# EasyEDA Pro project ProPrj_CSDR_2026-11-13.epro, schematic Schematic1, sheets 5 to 10 of 14

## Sheets
5 TX_MIXER: Create Date: 2026-09-30; Page Name: P1; Update Date: 2026-09-30
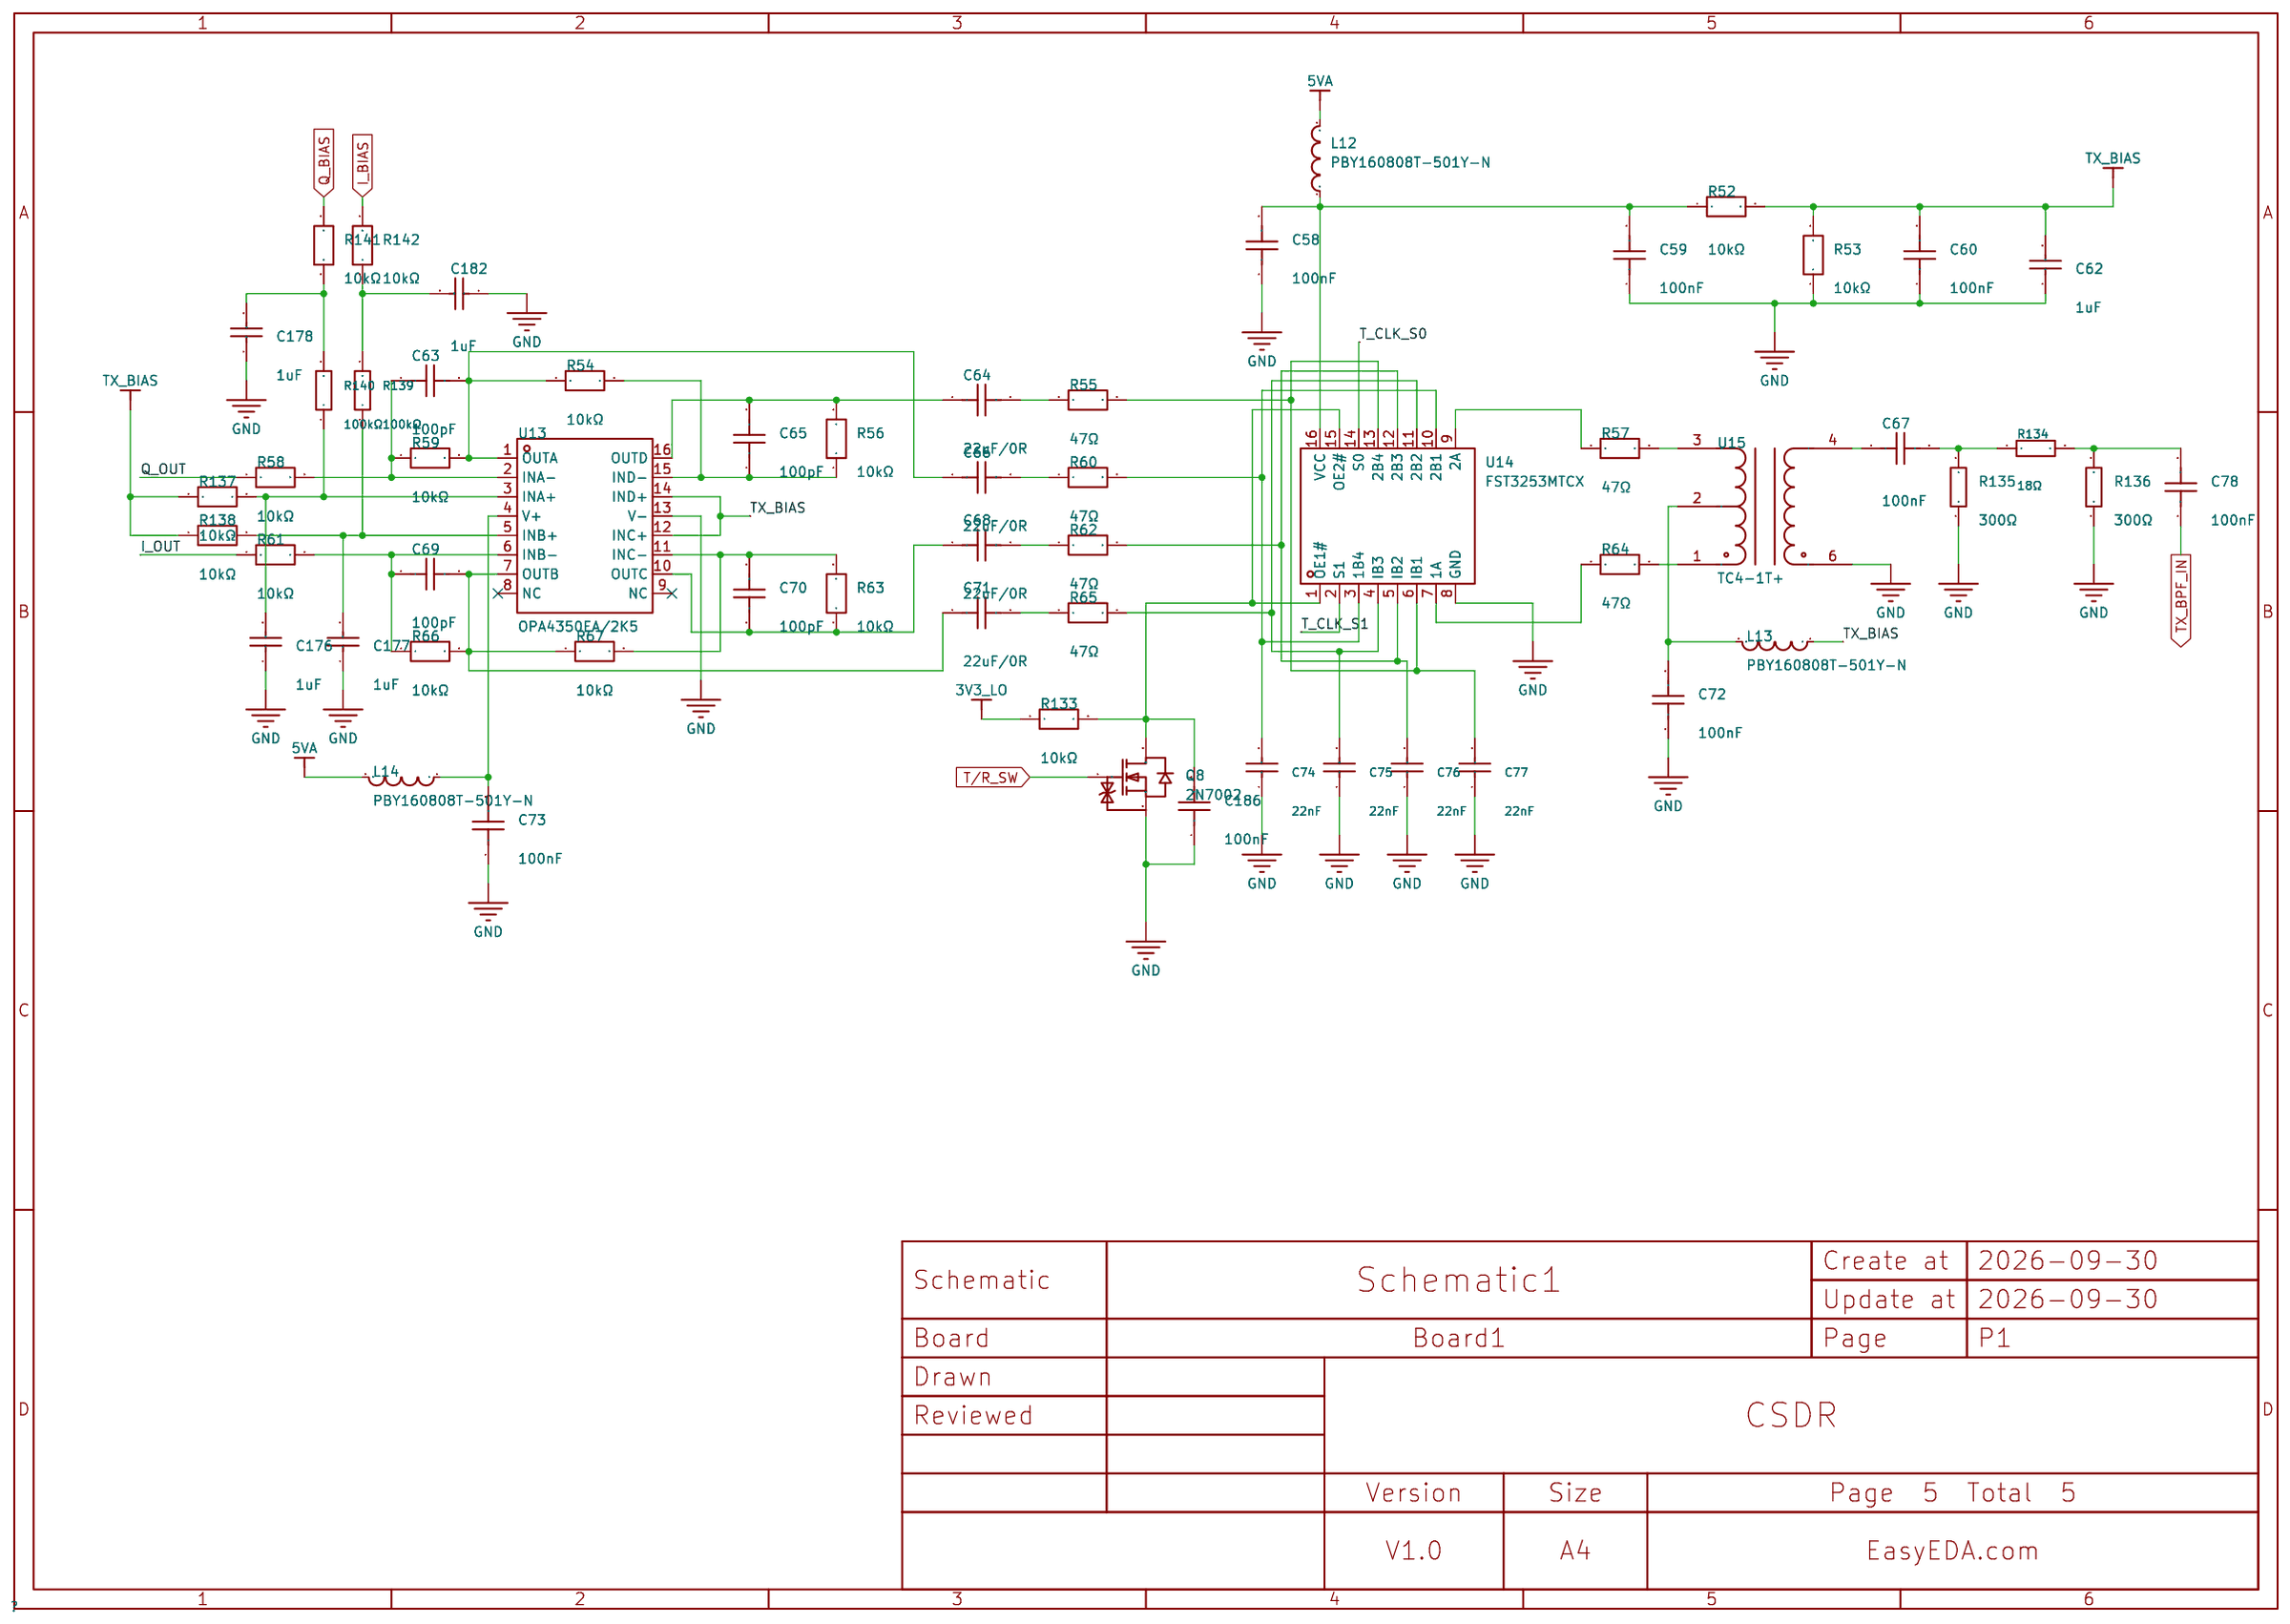
[diagram p6: TX_MIXER]
6 TX_MIXER_PREAMP: Create Date: 2026-10-01; Page Name: P1; Update Date: 2026-10-01
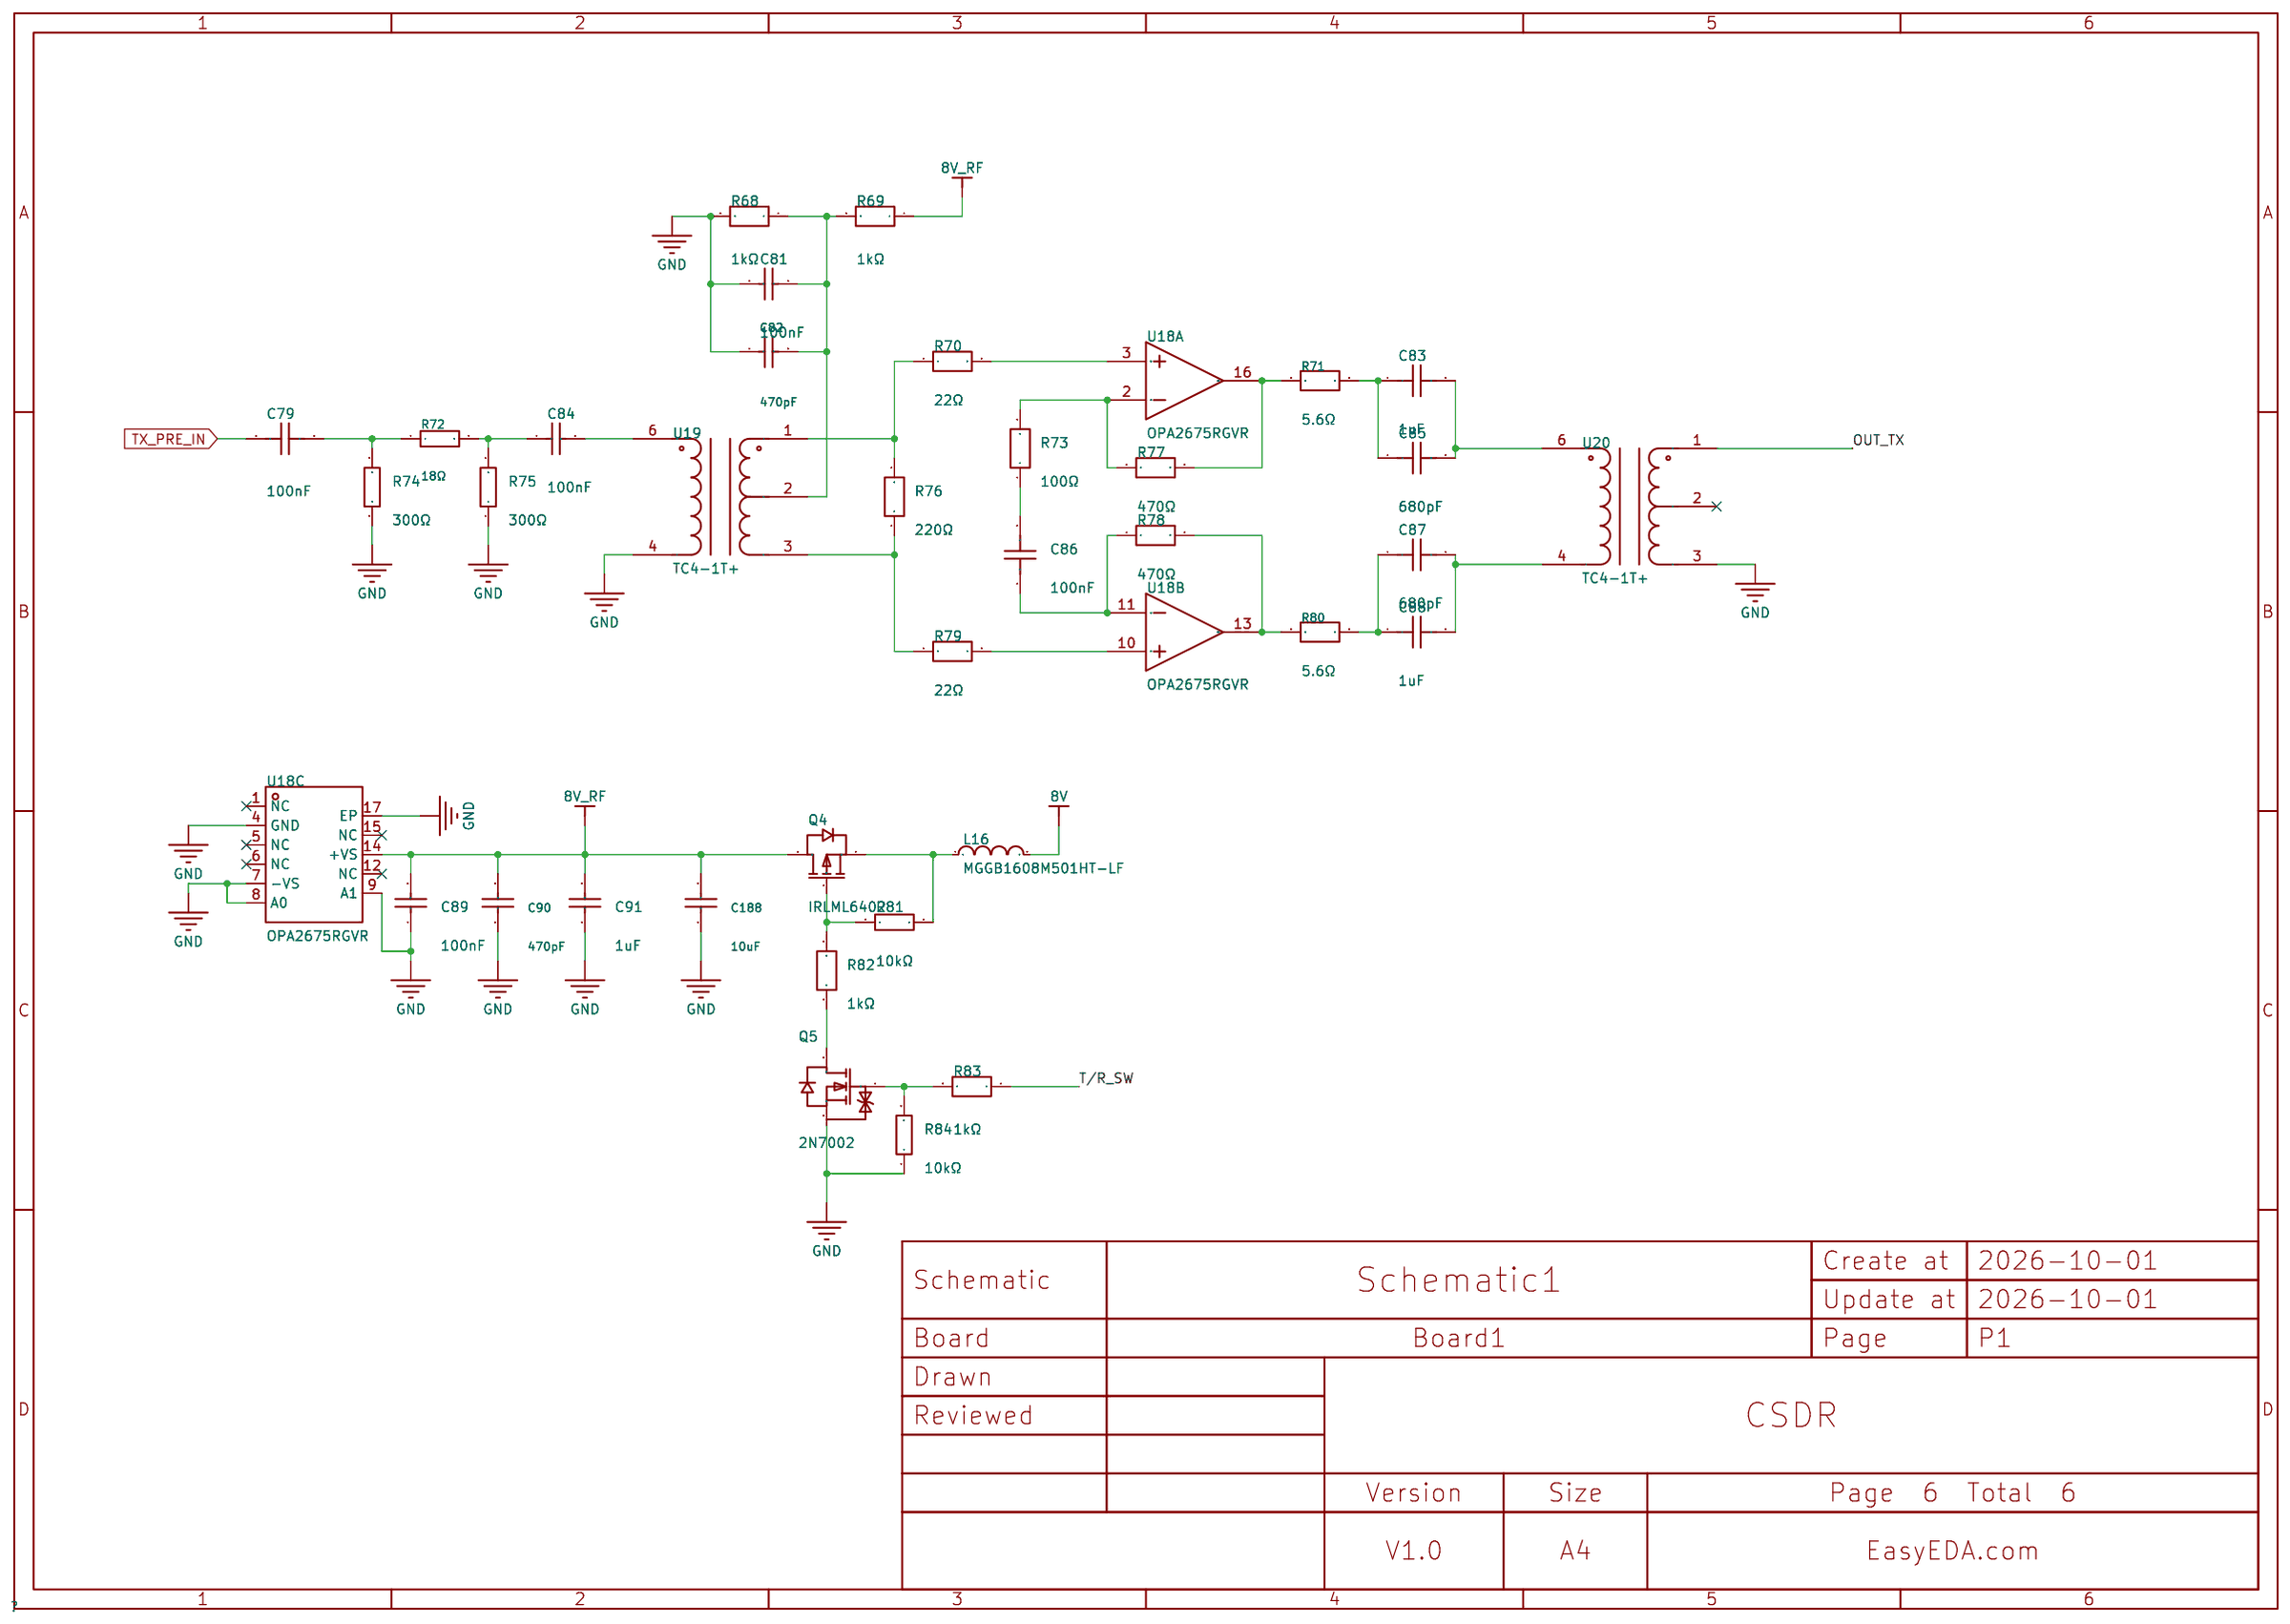
[diagram p7: TX_MIXER_PREAMP]
7 BPF_CONTROL: Create Date: 2026-10-02; Page Name: P1; Update Date: 2026-10-02
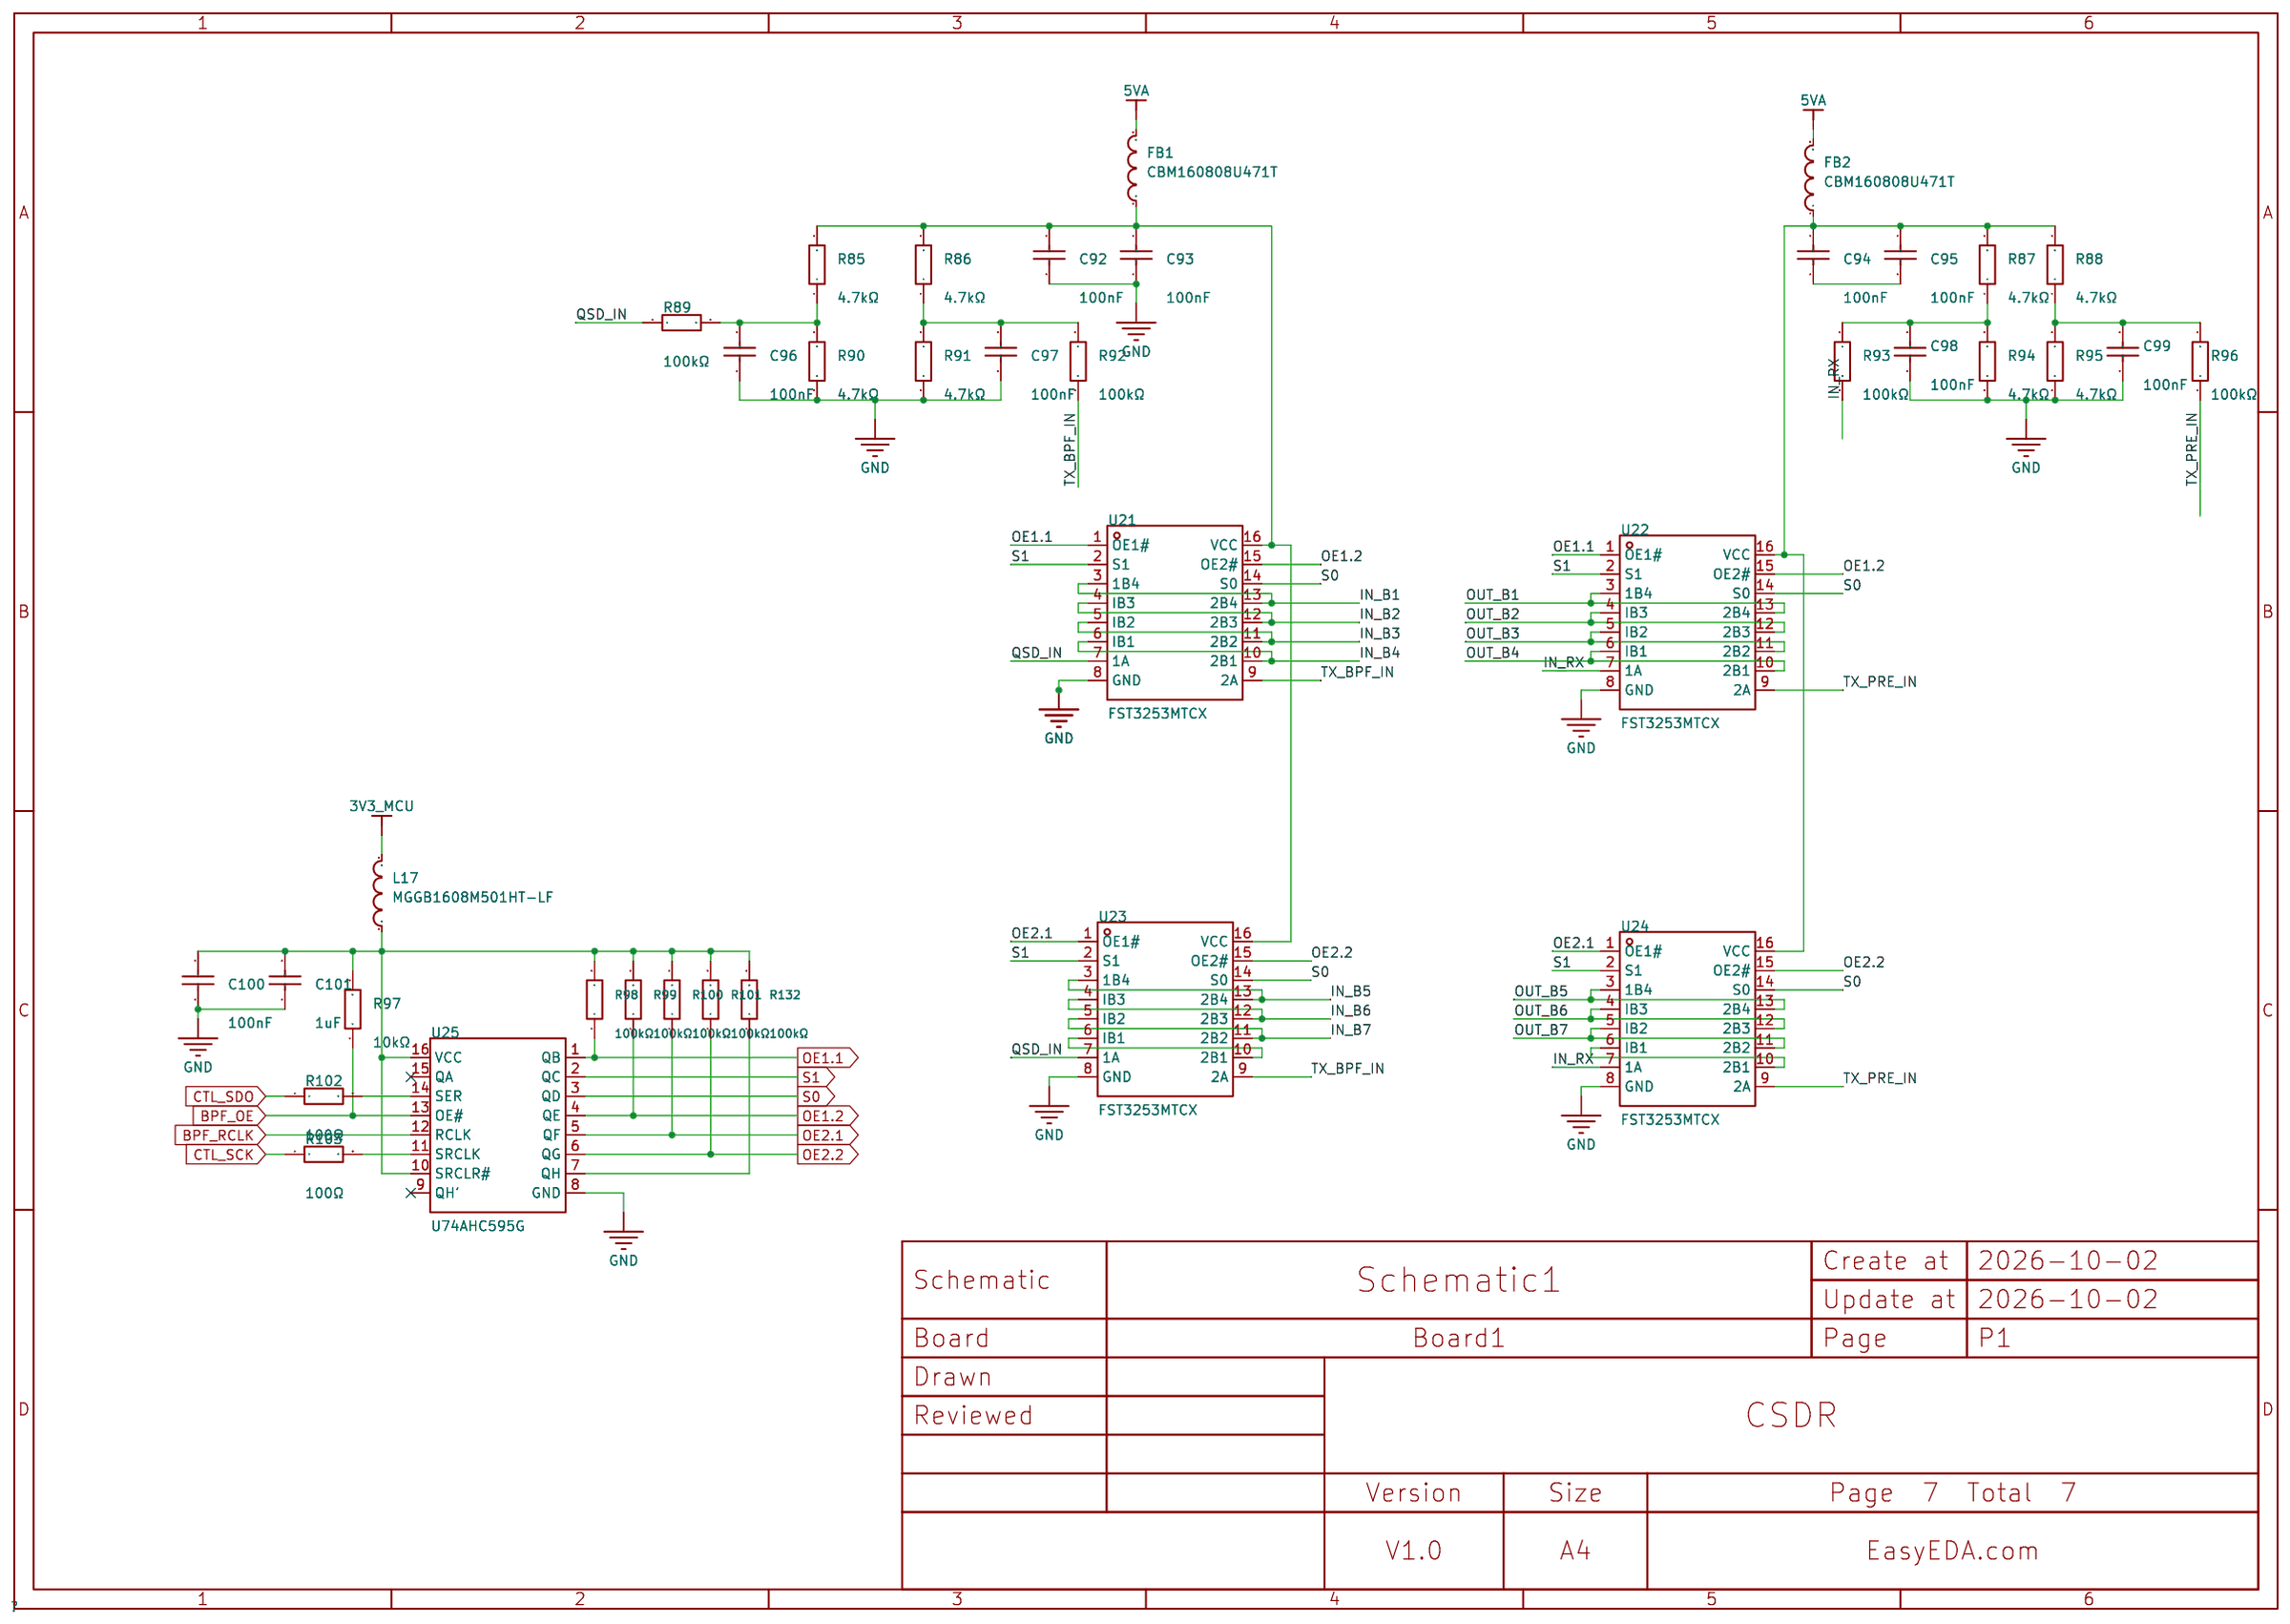
[diagram p8: BPF_CONTROL]
8 BPF: Create Date: 2026-10-03; Update Date: 2026-10-03
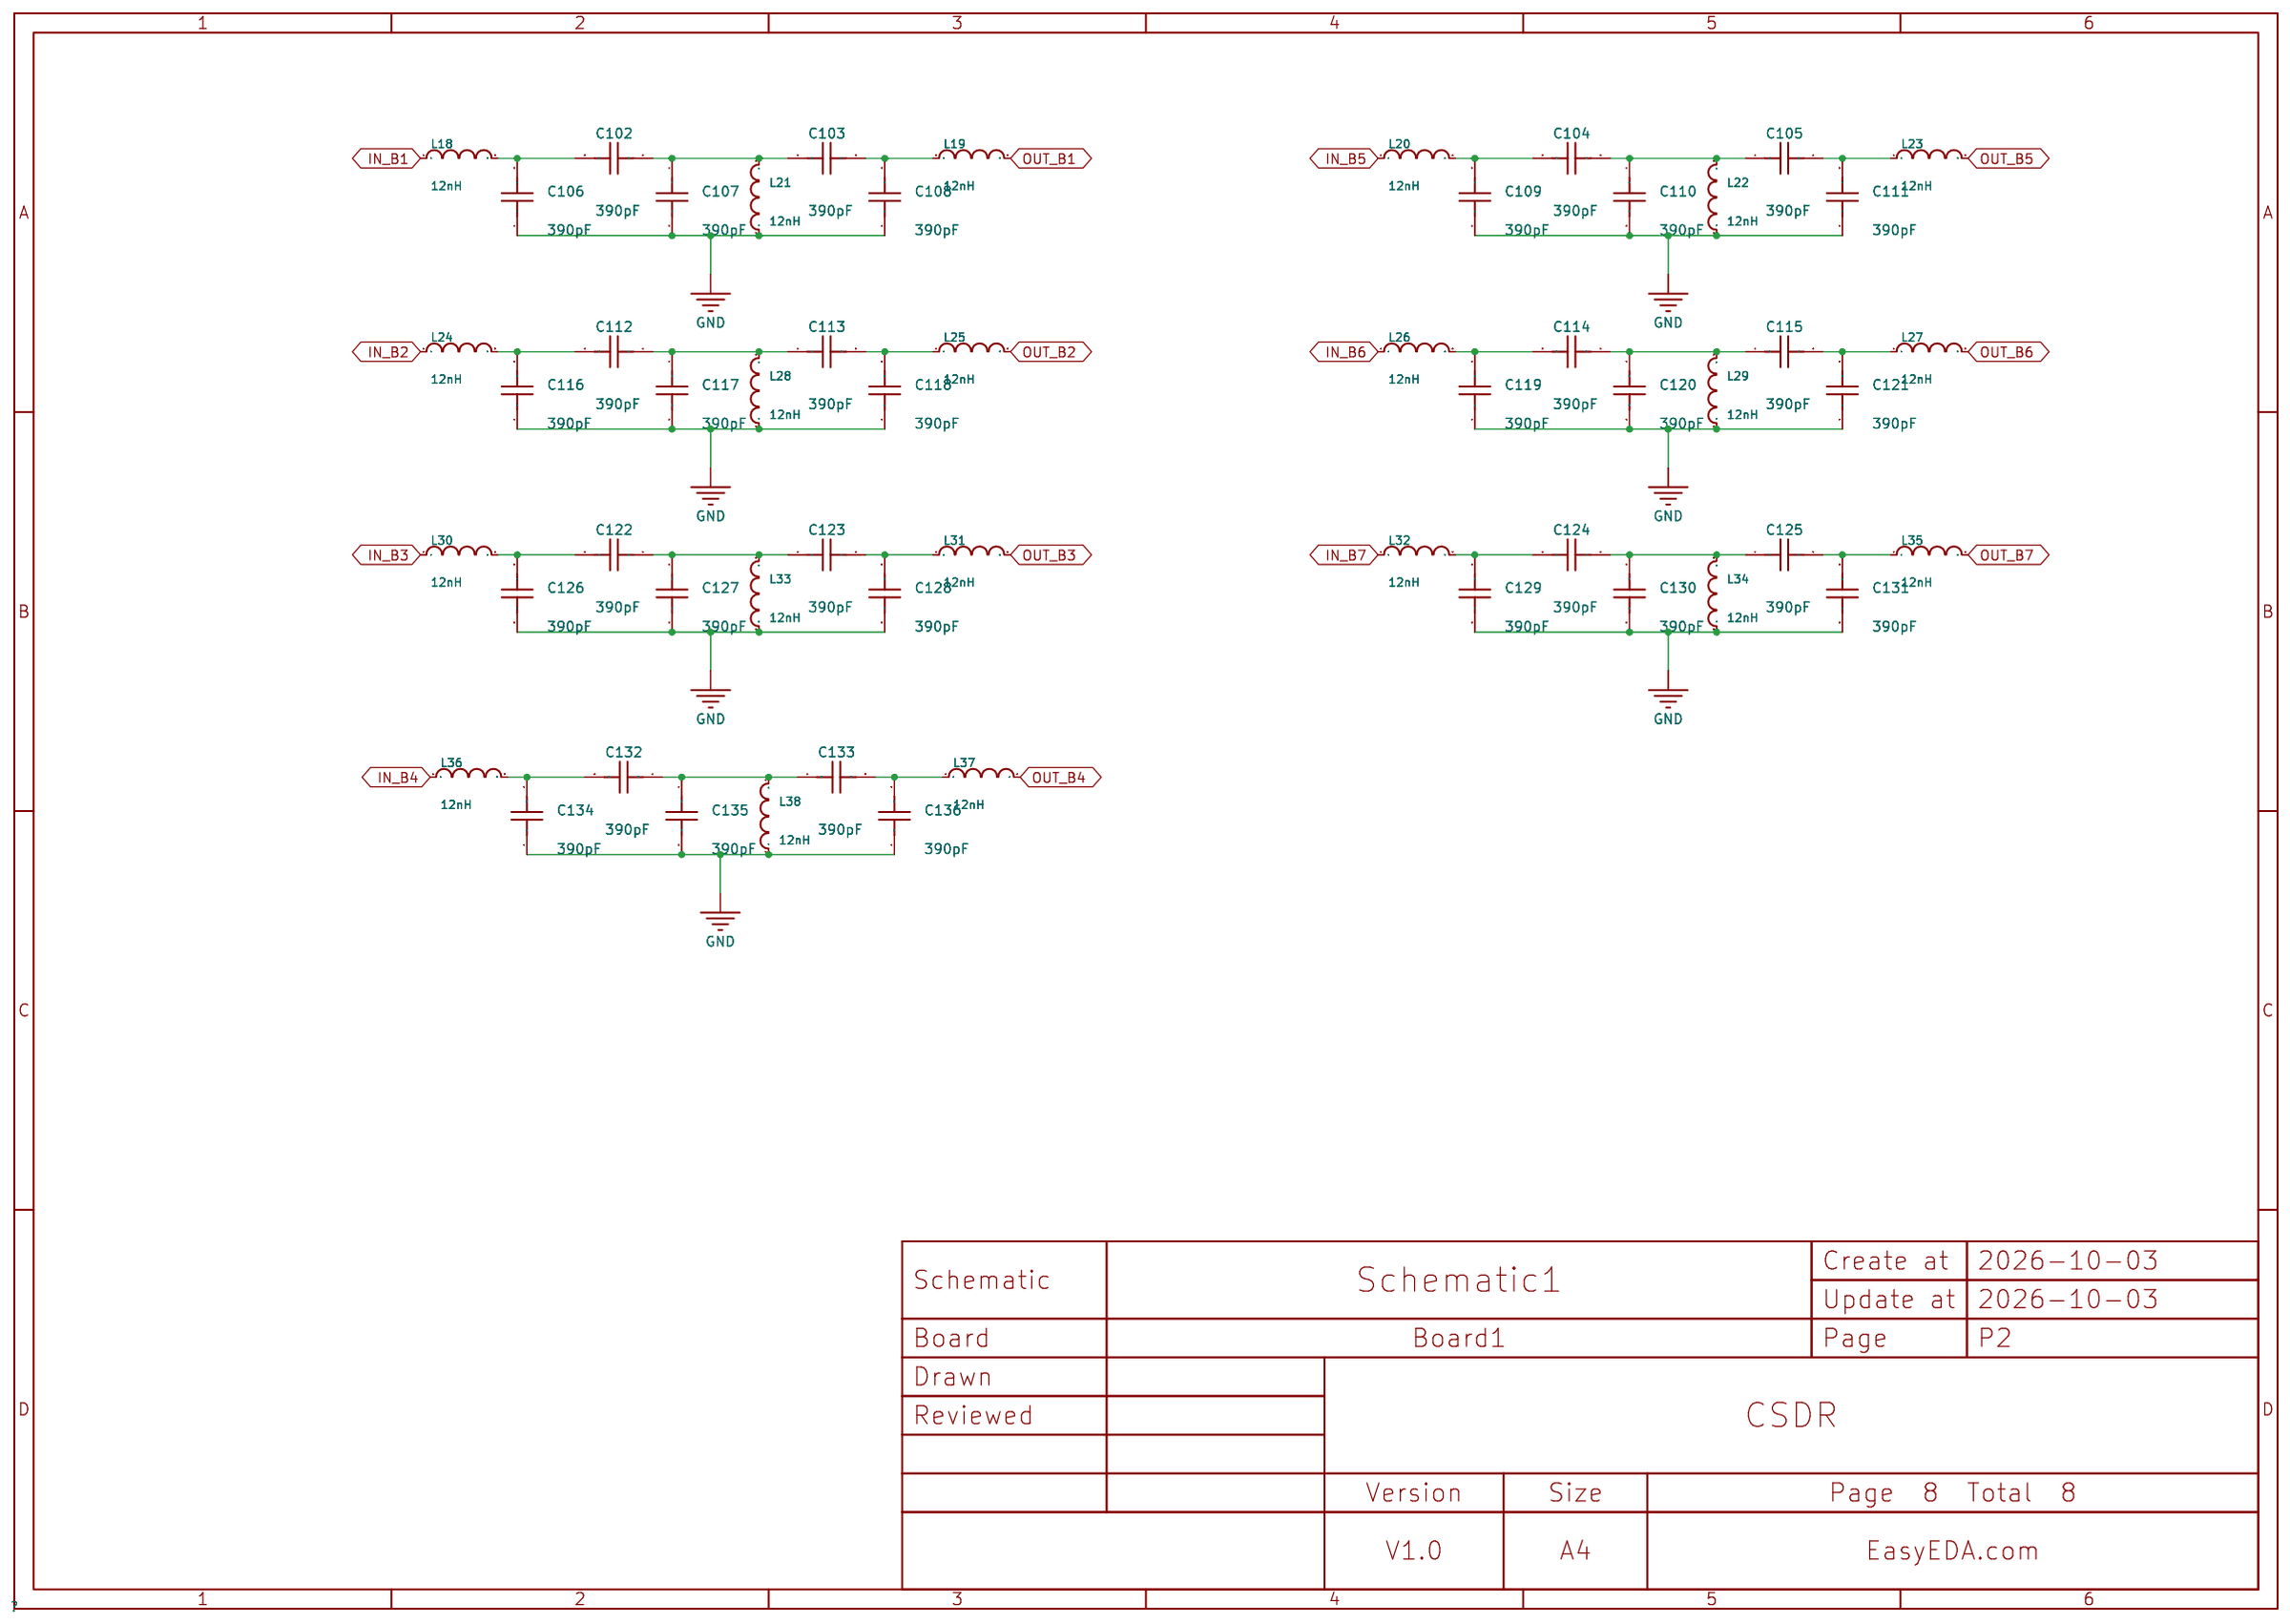
[diagram p9: BPF]
9 LPF_CONTROL: Create Date: 2026-10-03; Page Name: P1; Update Date: 2026-10-03
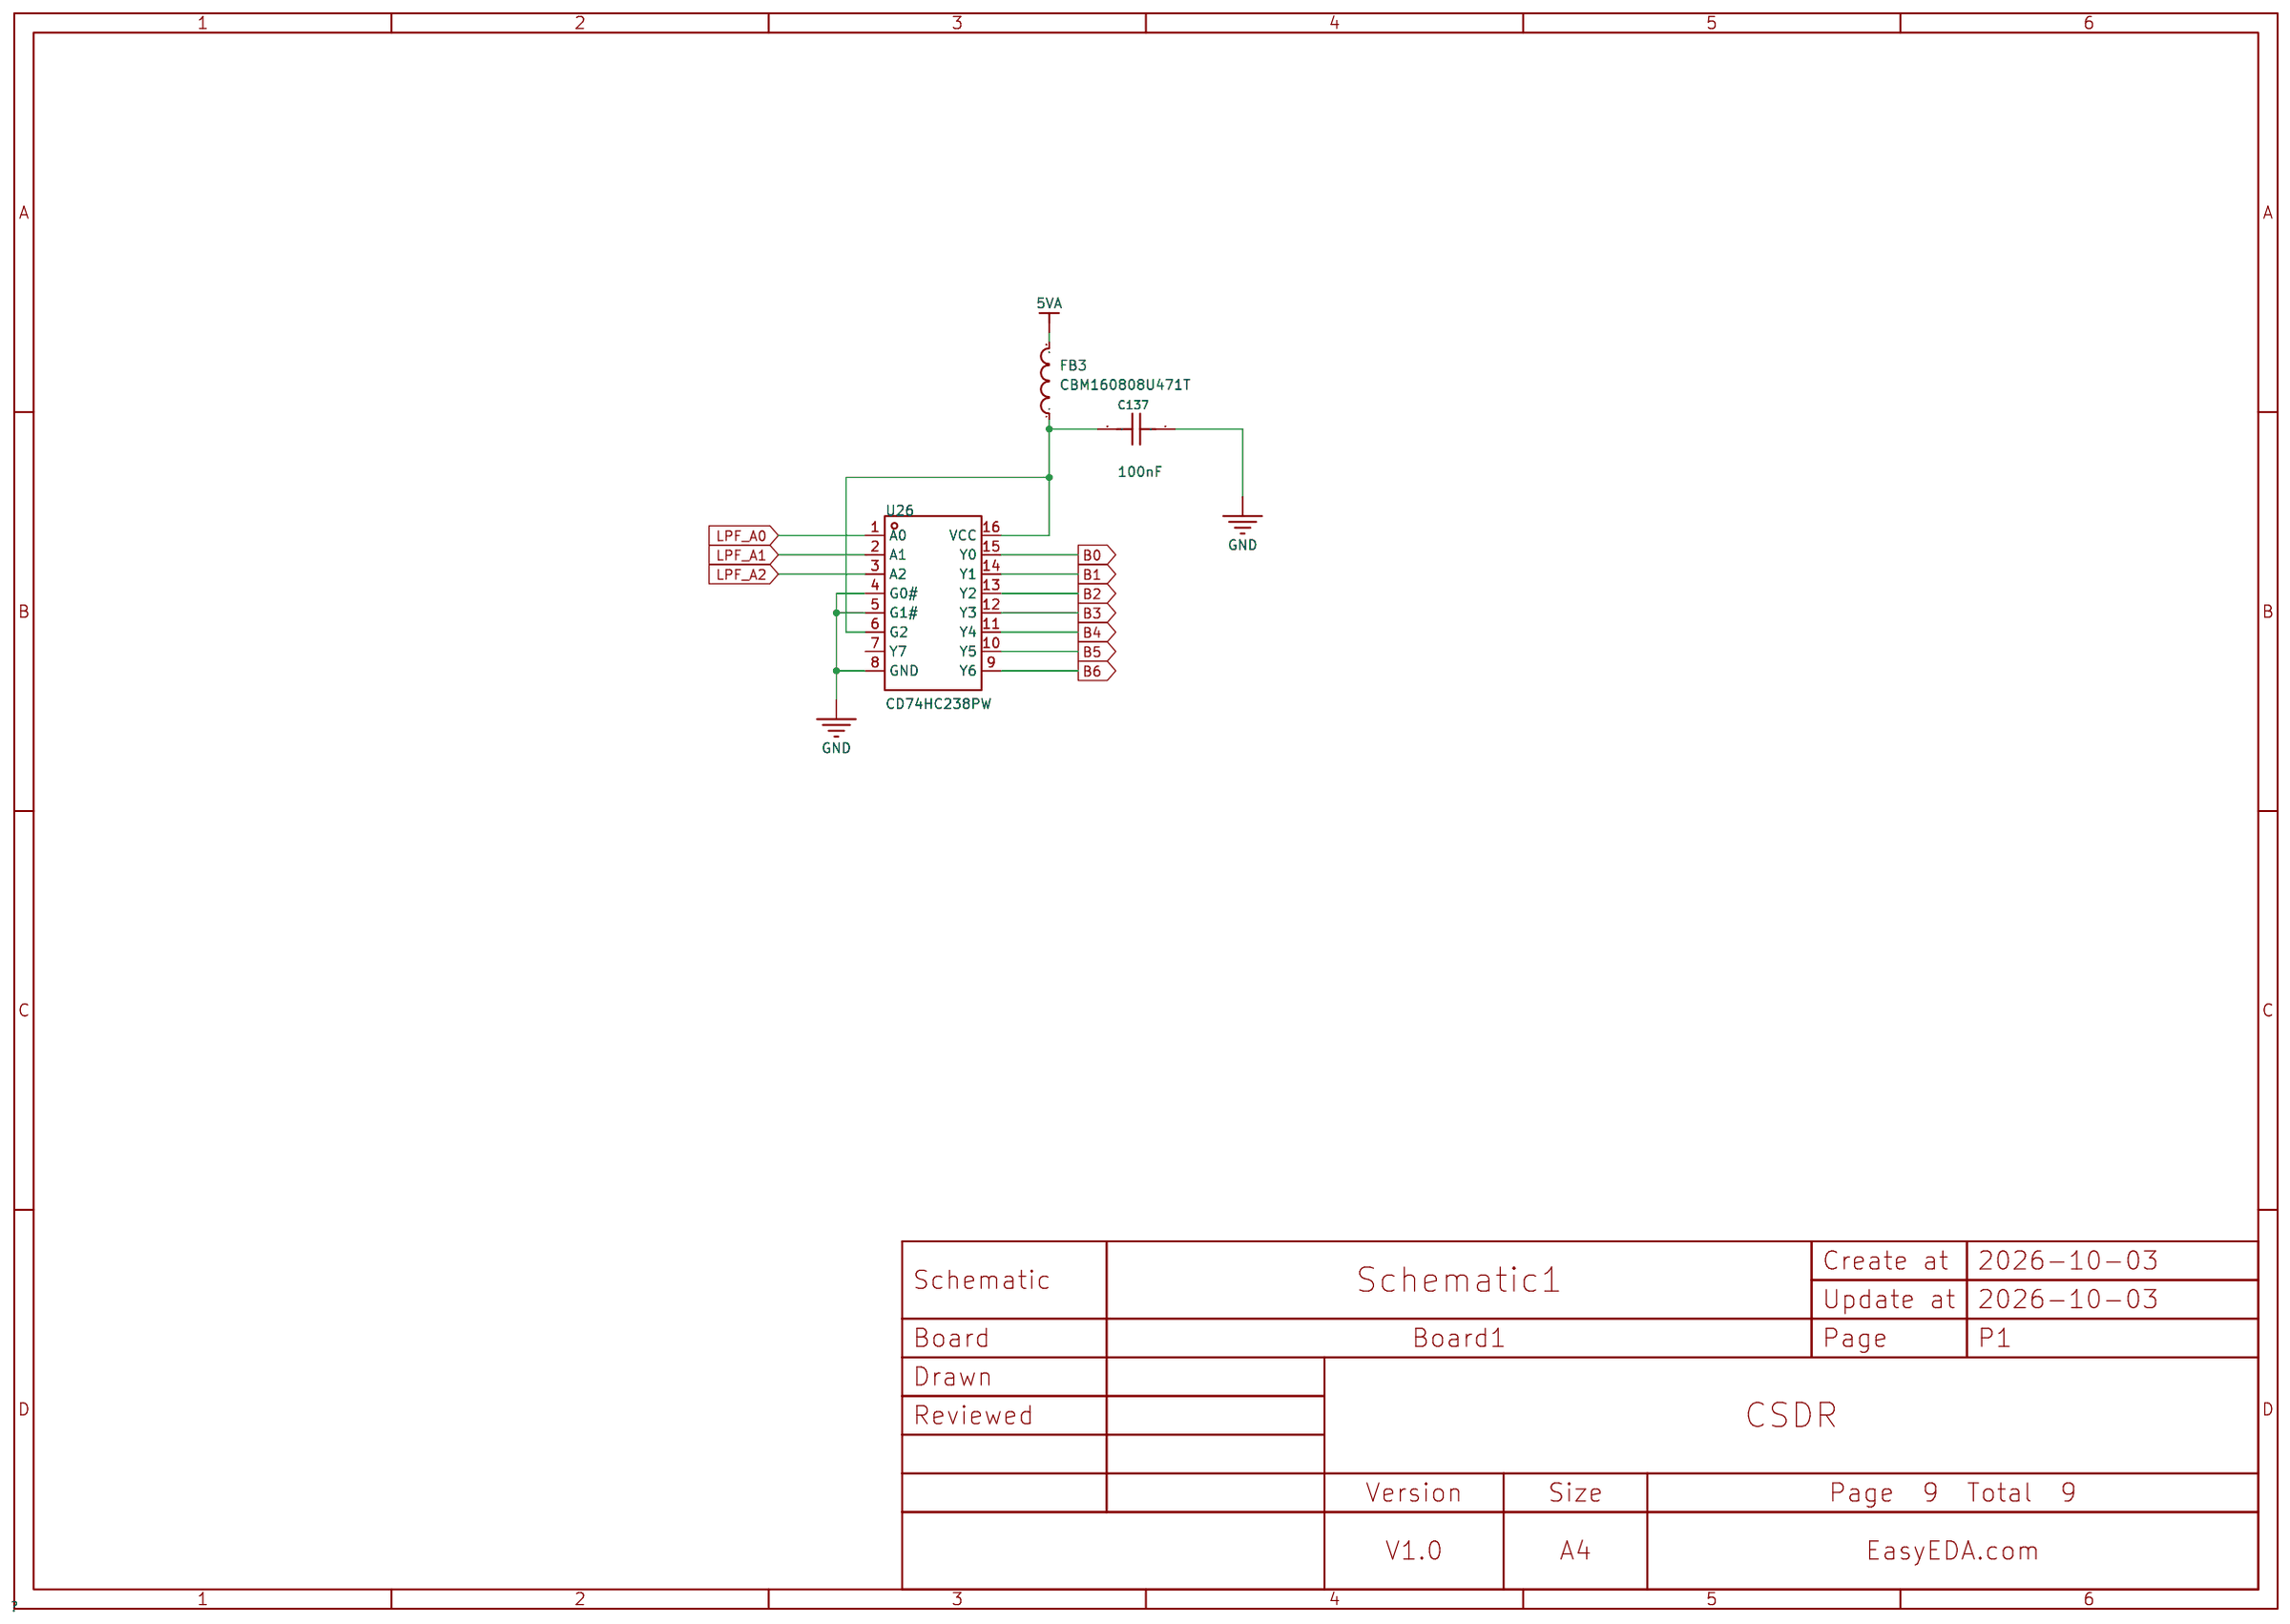
[diagram p10: LPF_CONTROL]
10 ATT: Create Date: 2026-10-03; Page Name: P1; Update Date: 2026-10-03
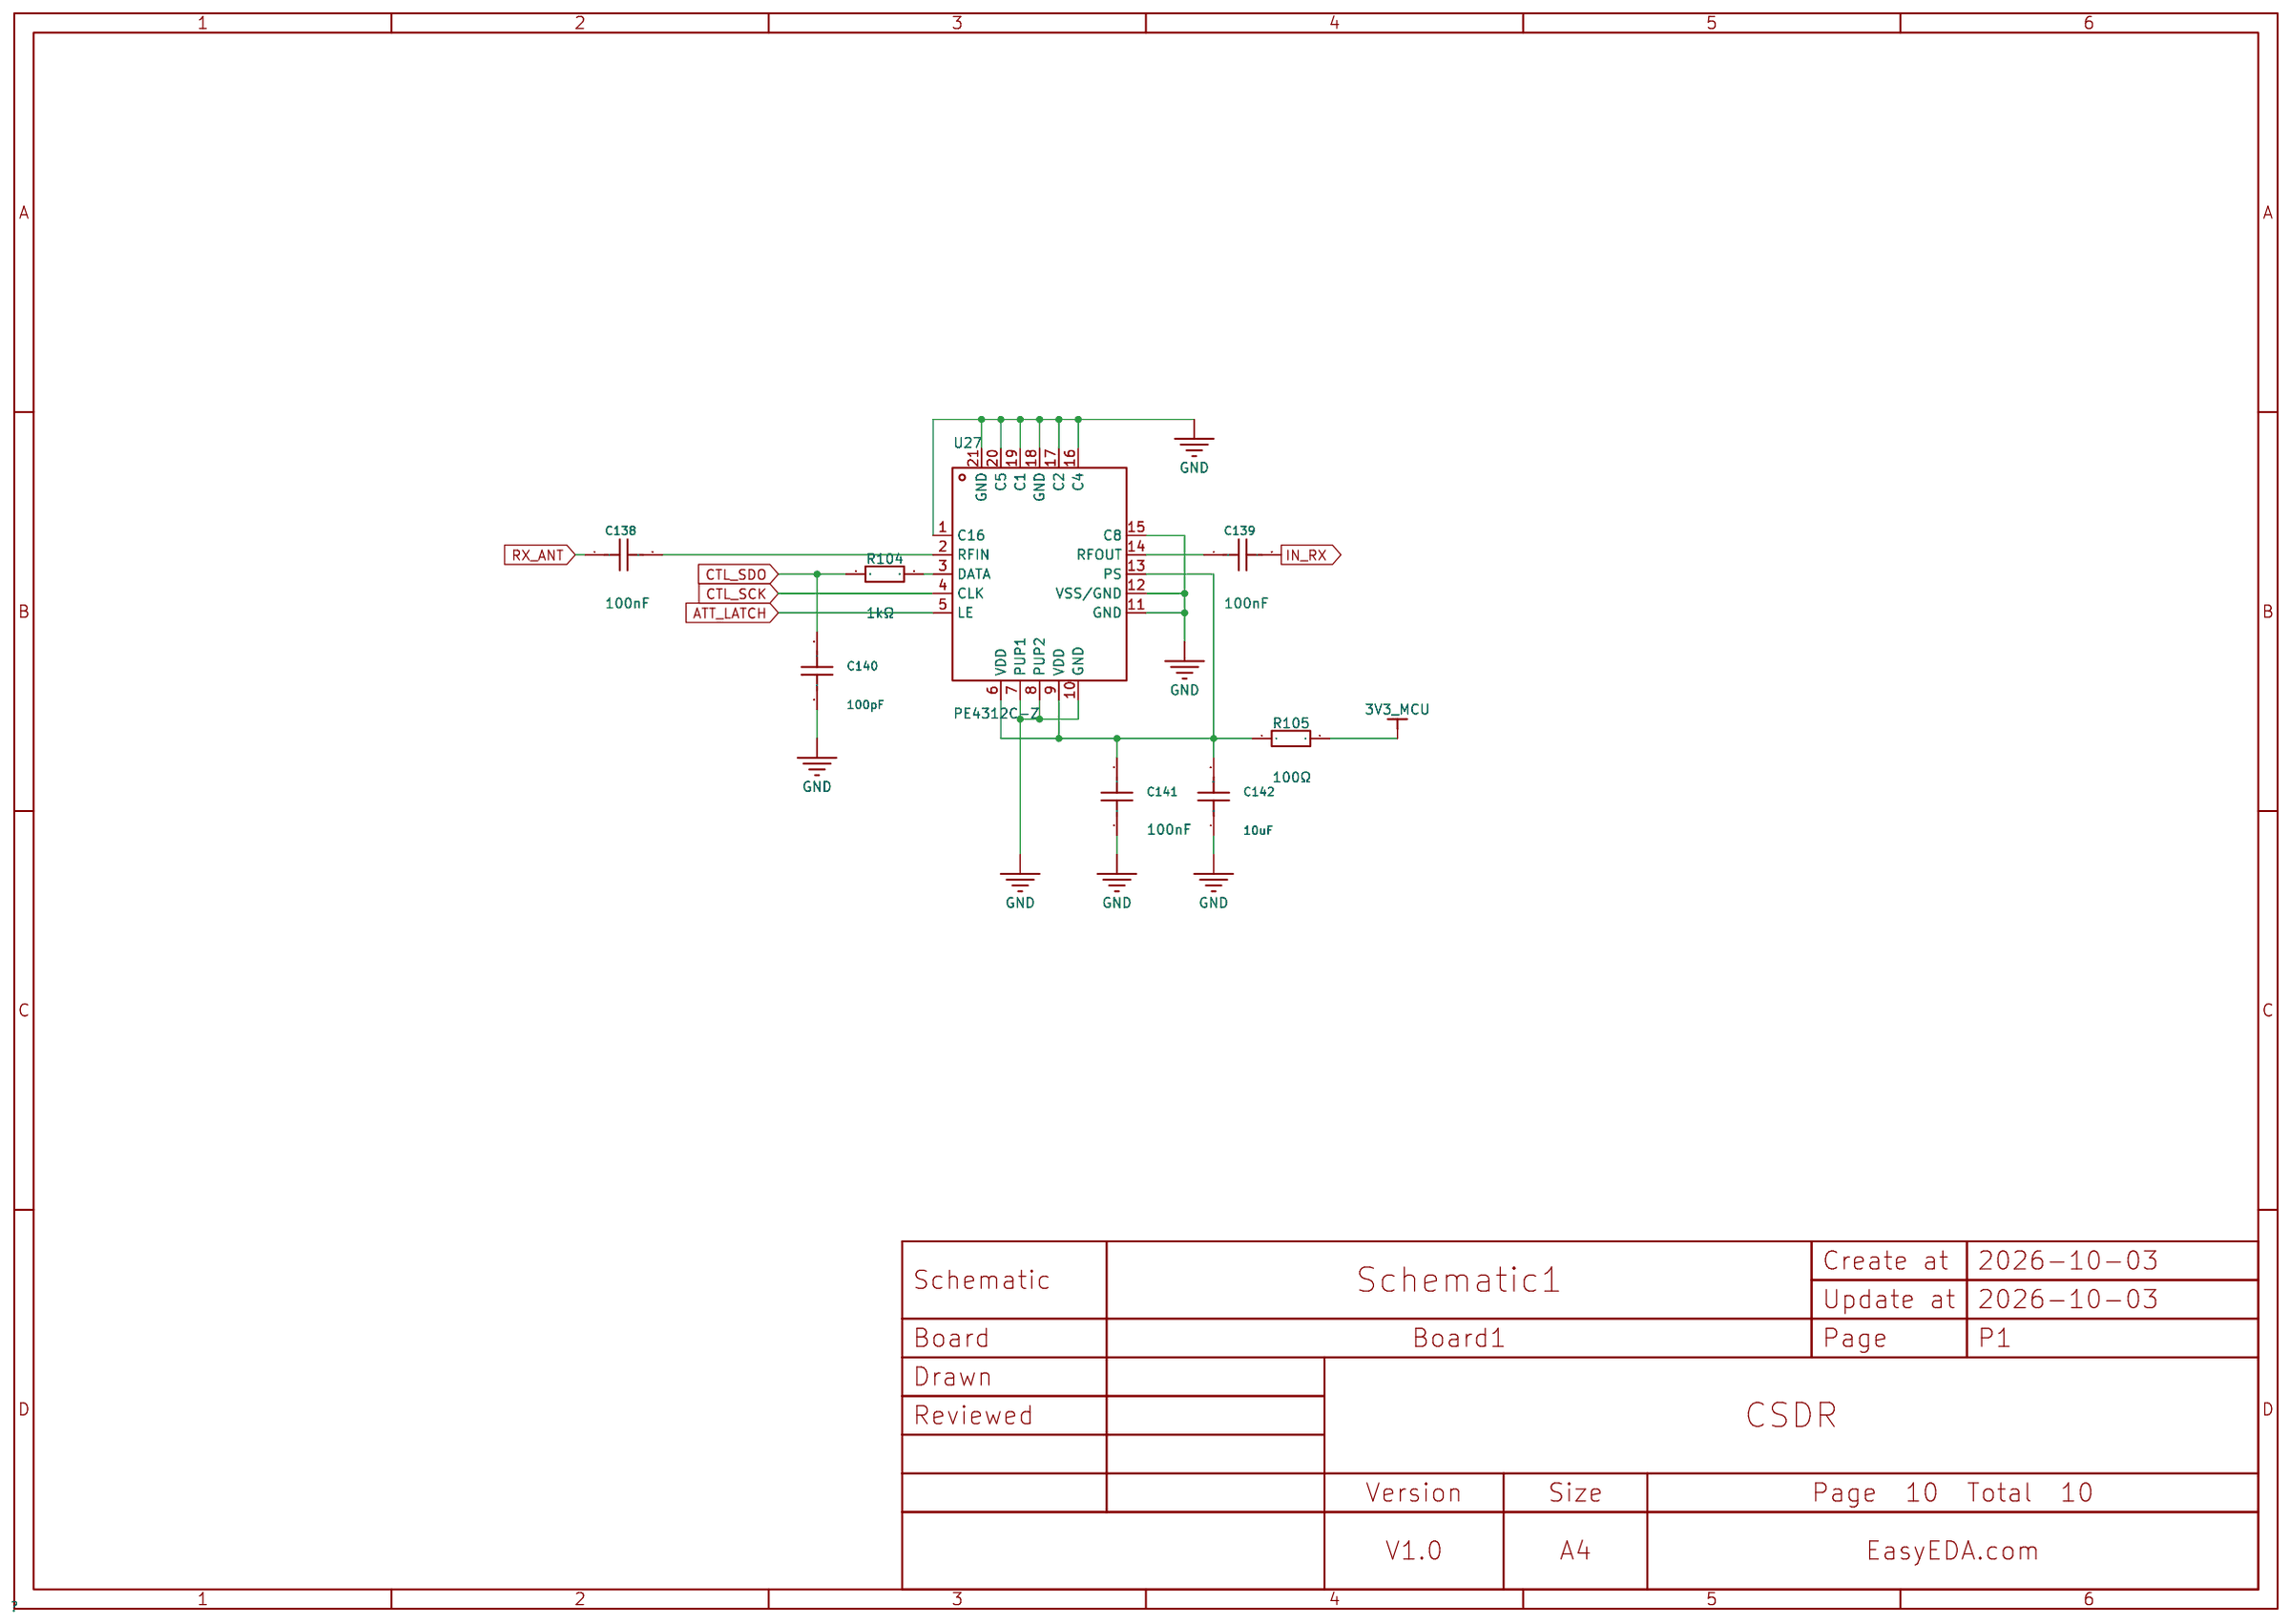
[diagram p11: ATT]

## Parts
sheet ATT
C138  100nF  [C0603]
C139  100nF  [C0603]
C140  100pF  [C0603]
C141  100nF  [C0603]
C142  10uF  [C0603]
R104  1kΩ  [R0603]
R105  100Ω  [R0603]
U27  PE4312C-Z  [QFN-20_L4.0-W4.0-P0.50-BL-EP2.2]
sheet BPF
C102  390pF  [C0603]
C103  390pF  [C0603]
C104  390pF  [C0603]
C105  390pF  [C0603]
C106  390pF  [C0603]
C107  390pF  [C0603]
C108  390pF  [C0603]
C109  390pF  [C0603]
C110  390pF  [C0603]
C111  390pF  [C0603]
C112  390pF  [C0603]
C113  390pF  [C0603]
C114  390pF  [C0603]
C115  390pF  [C0603]
C116  390pF  [C0603]
C117  390pF  [C0603]
C118  390pF  [C0603]
C119  390pF  [C0603]
C120  390pF  [C0603]
C121  390pF  [C0603]
C122  390pF  [C0603]
C123  390pF  [C0603]
C124  390pF  [C0603]
C125  390pF  [C0603]
C126  390pF  [C0603]
C127  390pF  [C0603]
C128  390pF  [C0603]
C129  390pF  [C0603]
C130  390pF  [C0603]
C131  390pF  [C0603]
C132  390pF  [C0603]
C133  390pF  [C0603]
C134  390pF  [C0603]
C135  390pF  [C0603]
C136  390pF  [C0603]
L18  12nH  [L1210]
L19  12nH  [L1210]
L20  12nH  [L1210]
L21  12nH  [L1210]
L22  12nH  [L1210]
L23  12nH  [L1210]
L24  12nH  [L1210]
L25  12nH  [L1210]
L26  12nH  [L1210]
L27  12nH  [L1210]
L28  12nH  [L1210]
L29  12nH  [L1210]
L30  12nH  [L1210]
L31  12nH  [L1210]
L32  12nH  [L1210]
L33  12nH  [L1210]
L34  12nH  [L1210]
L35  12nH  [L1210]
L36  12nH  [L1210]
L37  12nH  [L1210]
L38  12nH  [L1210]
sheet BPF_CONTROL
C92  100nF  [C0603]
C93  100nF  [C0603]
C94  100nF  [C0603]
C95  100nF  [C0603]
C96  100nF  [C0603]
C97  100nF  [C0603]
C98  100nF  [C0603]
C99  100nF  [C0603]
C100  100nF  [C0603]
C101  1uF  [C0603]
FB1  CBM160808U471T  [L0603]
FB2  CBM160808U471T  [L0603]
L17  MGGB1608M501HT-LF  [L0603]
R85  4.7kΩ  [R0603]
R86  4.7kΩ  [R0603]
R87  4.7kΩ  [R0603]
R88  4.7kΩ  [R0603]
R89  100kΩ  [R0603]
R90  4.7kΩ  [R0603]
R91  4.7kΩ  [R0603]
R92  100kΩ  [R0603]
R93  100kΩ  [R0603]
R94  4.7kΩ  [R0603]
R95  4.7kΩ  [R0603]
R96  100kΩ  [R0603]
R97  10kΩ  [R0603]
R98  100kΩ  [R0603]
R99  100kΩ  [R0603]
R100  100kΩ  [R0603]
R101  100kΩ  [R0603]
R102  100Ω  [R0603]
R103  100Ω  [R0603]
R132  100kΩ  [R0603]
U21  FST3253MTCX  [TSSOP-16_L5.0-W4.4-P0.65-LS6.4-BL]
U22  FST3253MTCX  [TSSOP-16_L5.0-W4.4-P0.65-LS6.4-BL]
U23  FST3253MTCX  [TSSOP-16_L5.0-W4.4-P0.65-LS6.4-BL]
U24  FST3253MTCX  [TSSOP-16_L5.0-W4.4-P0.65-LS6.4-BL]
U25  U74AHC595G  [TSSOP-16_L5.0-W4.4-P0.65-LS6.4-BL]
sheet LPF_CONTROL
C137  100nF  [C0603]
FB3  CBM160808U471T  [L0603]
U26  CD74HC238PW  [TSSOP-16_L5.0-W4.4-P0.65-LS6.4-BL]
sheet TX_MIXER
C58  100nF  [C0603]
C59  100nF  [C0603]
C60  100nF  [C0603]
C62  1uF  [C0603]
C63  100pF  [C0603]
C64  22uF/0R  [C0805]
C65  100pF  [C0603]
C66  22uF/0R  [C0805]
C67  100nF  [C0603]
C68  22uF/0R  [C0805]
C69  100pF  [C0603]
C70  100pF  [C0603]
C71  22uF/0R  [C0805]
C72  100nF  [C0603]
C73  100nF  [C0603]
C74  22nF  [C0603]
C75  22nF  [C0603]
C76  22nF  [C0603]
C77  22nF  [C0603]
C78  100nF  [C0603]
C176  1uF  [C0603]
C177  1uF  [C0603]
C178  1uF  [C0603]
C182  1uF  [C0603]
C186  100nF  [C0603]
L12  PBY160808T-501Y-N  [L0603]
L13  PBY160808T-501Y-N  [L0603]
L14  PBY160808T-501Y-N  [L0603]
Q8  2N7002  [SOT-23-3_L2.9-W1.5-P1.90-LS2.6-BR]
R52  10kΩ  [R0603]
R53  10kΩ  [R0603]
R54  10kΩ  [R0603]
R55  47Ω  [R0603]
R56  10kΩ  [R0603]
R57  47Ω  [R0603]
R58  10kΩ  [R0603]
R59  10kΩ  [R0603]
R60  47Ω  [R0603]
R61  10kΩ  [R0603]
R62  47Ω  [R0603]
R63  10kΩ  [R0603]
R64  47Ω  [R0603]
R65  47Ω  [R0603]
R66  10kΩ  [R0603]
R67  10kΩ  [R0603]
R133  10kΩ  [R0603]
R134  18Ω  [R0603]
R135  300Ω  [R0603]
R136  300Ω  [R0603]
R137  10kΩ  [R0603]
R138  10kΩ  [R0603]
R139  100kΩ  [R0603]
R140  100kΩ  [R0603]
R141  10kΩ  [R0603]
R142  10kΩ  [R0603]
U13  OPA4350EA/2K5  [SSOP-16_L4.9-W3.9-P0.64-LS6.0-BL]
U14  FST3253MTCX  [TSSOP-16_L5.0-W4.4-P0.65-LS6.4-BL]
U15  TC4-1T+  [XFMR-SMD_TC1-1TX]
sheet TX_MIXER_PREAMP
C79  100nF  [C0603]
C81  100nF  [C0603]
C82  470pF  [C0603]
C83  1uF  [C0603]
C84  100nF  [C0603]
C85  680pF  [C0603]
C86  100nF  [C0603]
C87  680pF  [C0603]
C88  1uF  [C0603]
C89  100nF  [C0603]
C90  470pF  [C0603]
C91  1uF  [C0603]
C188  10uF  [C0603]
L16  MGGB1608M501HT-LF  [L0603]
Q4  IRLML6402  [SOT-23-3_L2.9-W1.3-P1.90-LS2.4-BR]
Q5  2N7002  [SOT-23-3_L2.9-W1.5-P1.90-LS2.6-BR]
R68  1kΩ  [R0603]
R69  1kΩ  [R0603]
R70  22Ω  [R0603]
R71  5.6Ω  [R0603]
R72  18Ω  [R0603]
R73  100Ω  [R0603]
R74  300Ω  [R0603]
R75  300Ω  [R0603]
R76  220Ω  [R0603]
R77  470Ω  [R0603]
R78  470Ω  [R0603]
R79  22Ω  [R0603]
R80  5.6Ω  [R0603]
R81  10kΩ  [R0603]
R82  1kΩ  [R0603]
R83  1kΩ  [R0603]
R84  10kΩ  [R0603]
U18  OPA2675RGVR  [QFN-16_L4.0-W4.0-P0.65-TL-EP2.2]  (sections 1,2,3)
U19  TC4-1T+  [XFMR-SMD_TC1-1TX]
U20  TC4-1T+  [XFMR-SMD_TC1-1TX]

## Library data of the parts
C137-C139 C141 = CC0603KRX7R9BB104: Capacitance:100nF Tolerance:±10% Tolerance:±10% Voltage Rating:50V Temperature Coefficient:X7R; LCSC Part Name: 100nF ±10% 50V; Supplier Part: C14663; Manufacturer: YAGEO(国巨); Supplier Footprint: 0603; JLCPCB Part Class: Basic Part; Datasheet: https://item.szlcsc.com/datasheet/CC0603KRX7R9BB104/15331.html; Supplier: LCSC; Tolerance: ±10%; Voltage Rating: 50V; Temperature Coefficient: X7R
C140 = CC0603JRNPO9BN101: Capacitance:100pF Tolerance:±5% Tolerance:±5% Voltage Rating:50V Temperature Coefficient:NP0; LCSC Part Name: 100pF ±5% 50V; Supplier Part: C14665; Manufacturer: YAGEO(国巨); Supplier Footprint: 0603; JLCPCB Part Class: Extended Part; Datasheet: https://item.szlcsc.com/datasheet/CC0603JRNPO9BN101/15333.html; Supplier: LCSC; Tolerance: ±5%; Voltage Rating: 50V; Temperature Coefficient: NP0
C142 = CL10A106MA8NRNC: Capacitance:10uF Tolerance:±20% Tolerance:±20% Voltage Rating:25V Temperature Coefficient:X5R; LCSC Part Name: 10uF ±20% 25V; Supplier Part: C96446; Manufacturer: SAMSUNG(三星); Supplier Footprint: 0603; JLCPCB Part Class: Basic Part; Datasheet: https://item.szlcsc.com/datasheet/CL10A106MA8NRNC/97651.html; Supplier: LCSC; Tolerance: ±20%; Voltage Rating: 25V; Temperature Coefficient: X5R
R104 = RC0603FR-071KL: Type:Thick Film Resistor Resistance:1kΩ Tolerance:±1% Tolerance:±1% Power(Watts):100mW Voltage-Supply(Max):75V Temperature Coefficient:±100ppm/℃ Temperature Coefficient:±100ppm/℃ Operating Temperature:-55℃~+155℃ Operating Temperature:-55℃~+155℃; LCSC Part Name: 厚膜电阻 1kΩ ±1%; Supplier Part: C22548; Manufacturer: YAGEO(国巨); Supplier Footprint: 0603; JLCPCB Part Class: Extended Part; Datasheet: https://item.szlcsc.com/datasheet/RC0603FR-071KL/23274.html; Supplier: LCSC; Type: Thick Film Resistor; Tolerance: ±1%; Power(Watts): 100mW; Voltage-Supply(Max): 75V; Temperature Coefficient: ±100ppm/℃; Operating Temperature: -55℃~+155℃
R102 R103 R105 = AC0603FR-07100RL: Type:Thick Film Resistor Resistance:100Ω Tolerance:±1% Tolerance:±1% Power(Watts):100mW Voltage-Supply(Max):75V Temperature Coefficient:±100ppm/℃ Temperature Coefficient:±100ppm/℃ Operating Temperature:-55℃~+155℃ Operating Temperature:-55℃~+155℃; LCSC Part Name: 厚膜电阻 100Ω ±1% 100mW; Supplier Part: C125923; Manufacturer: YAGEO(国巨); Supplier Footprint: 0603; JLCPCB Part Class: Extended Part; Datasheet: https://item.szlcsc.com/datasheet/AC0603FR-07100RL/137203.html; Supplier: LCSC; Type: Thick Film Resistor; Tolerance: ±1%; Power(Watts): 100mW; Voltage-Supply(Max): 75V; Temperature Coefficient: ±100ppm/℃; Operating Temperature: -55℃~+155℃
U27 = PE4312C-Z: Frequency Range:1MHz~4GHz Frequency Range:1MHz~4GHz Impedance:50Ω Attenuation Value:31.5dB Attenuation Value:31.5dB Operating Temperature:-55℃~+105℃ Operating Temperature:-55℃~+105℃ Step Size:0.5dB Insertion Loss:1.3dB；1.5dB；2.1dB Features:Parallel contro; LCSC Part Name: 6位31.5dB 1MHz-4GHz RF数字步进衰减器; Supplier Part: C500480; Manufacturer: pSemi(游隼半导体); Supplier Footprint: QFN-20-EP(4x4); JLCPCB Part Class: Extended Part; Datasheet: https://item.szlcsc.com/datasheet/PE4312C-Z/512678.html; Supplier: LCSC; Frequency Range: 1MHz~4GHz; Impedance: 50Ω; Attenuation Value: 31.5dB; Operating Temperature: -55℃~+105℃; Step Size: 0.5dB; Insertion Loss: 1.3dB；1.5dB；2.1dB; Features: Parallel control interface；Digitally programmable attenuation；Digital control interface
C102-C136 = GRM1885C1H391JA01D: Capacitance:390pF Tolerance:±5% Tolerance:±5% Voltage Rating:50V Temperature Coefficient:C0G; LCSC Part Name: 390pF ±5% 50V; Supplier Part: C701309; Manufacturer: muRata(村田); Supplier Footprint: 0603; JLCPCB Part Class: Extended Part; Datasheet: https://item.szlcsc.com/datasheet/GRM1885C1H391JA01D/736240.html; Supplier: LCSC; Tolerance: ±5%; Voltage Rating: 50V; Temperature Coefficient: C0G
L18-L38 = NLV32T-012J-EF: Inductance: Tolerance:±5% Tolerance:±5% Rated Current: Saturation Current (Isat):- DC Resistance (DCR): Ratings:-; LCSC Part Name: 12nH ±5%; Supplier Part: C295171; Manufacturer: TDK; Supplier Footprint: 1210; JLCPCB Part Class: Extended Part; Datasheet: https://atta.szlcsc.com/upload/public/pdf/source/20190114/C295361_7F4084769062E2B02C18E7F2085EC2BC.pdf; Supplier: LCSC; Tolerance: ±5%
C81 C84 C89 C92-C100 = CT41G-0603-2X1-50V-0.1uF-K(N): Capacitance:100nF Tolerance:±10% Tolerance:±10% Voltage Rating:50V Temperature Coefficient:-; LCSC Part Name: 100nF ±10% 50V; Supplier Part: C125205; Manufacturer: TORCH(火炬); Supplier Footprint: 0603; JLCPCB Part Class: Extended Part; Datasheet: https://item.szlcsc.com/datasheet/CT41G-0603-2X1-50V-0.1uF-K(N)/136481.html; Supplier: LCSC; Tolerance: ±10%; Voltage Rating: 50V
C62 C91 C101 C176-C178 C182 = CL10A105KA8NNNC: Capacitance:1uF Tolerance:±10% Tolerance:±10% Voltage Rating:25V Temperature Coefficient:X5R; LCSC Part Name: 1uF ±10% 25V; Supplier Part: C5673; Manufacturer: SAMSUNG(三星); Supplier Footprint: 0603; JLCPCB Part Class: Extended Part; Datasheet: https://item.szlcsc.com/datasheet/CL10A105KA8NNNC/6132.html; Supplier: LCSC; Tolerance: ±10%; Voltage Rating: 25V; Temperature Coefficient: X5R
FB1-FB3 = CBM160808U471T: Impedance @ Frequency:470Ω@100MHz Tolerance:±25% Tolerance:±25% DC Resistance(DCR):- Current Rating:- Number of Circuits:1 Operating Temperature:-55℃~+125℃ Operating Temperature:-55℃~+125℃; LCSC Part Name: 单路 0603磁珠 阻抗470Ω@100MHz; Supplier Part: C394424; Manufacturer: FH(风华); Supplier Footprint: 0603; JLCPCB Part Class: Extended Part; Datasheet: https://item.szlcsc.com/datasheet/CBM160808U471T/373699.html; Supplier: LCSC; Impedance @ Frequency: 470Ω@100MHz; Tolerance: ±25%; Number of Circuits: 1; Operating Temperature: -55℃~+125℃
L16 L17 = MGGB1608M501HT-LF: Impedance @ Frequency:500Ω@100MHz Tolerance:±25% Tolerance:±25% DC Resistance(DCR):- Current Rating:- Number of Circuits:1 Operating Temperature:- Operating Temperature:-; LCSC Part Name: 单路 0603磁珠 阻抗500Ω@100MHz; Supplier Part: C281149; Manufacturer: microgate(麦捷科技); Supplier Footprint: 0603; JLCPCB Part Class: Extended Part; Datasheet: https://item.szlcsc.com/datasheet/MGGB1608M501HT-LF/267482.html; Supplier: LCSC; Impedance @ Frequency: 500Ω@100MHz; Tolerance: ±25%; Number of Circuits: 1
R85-R88 R90 R91 R94 R95 = 0603WAF4701T5E: Type:Thick Film Resistor Resistance:4.7kΩ Tolerance:±1% Tolerance:±1% Power(Watts):100mW Voltage-Supply(Max):75V Temperature Coefficient:±100ppm/℃ Temperature Coefficient:±100ppm/℃ Operating Temperature:-55℃~+155℃ Operating Temperature:-55℃~+155℃; LCSC Part Name: 厚膜电阻 4.7kΩ ±1%; Supplier Part: C23162; Manufacturer: UNI-ROYAL(厚声); Supplier Footprint: 0603; JLCPCB Part Class: Basic Part; Datasheet: https://item.szlcsc.com/datasheet/0603WAF4701T5E/23889.html; Supplier: LCSC; Type: Thick Film Resistor; Tolerance: ±1%; Power(Watts): 100mW; Voltage-Supply(Max): 75V; Temperature Coefficient: ±100ppm/℃; Operating Temperature: -55℃~+155℃
R89 R92 R93 R96 = 0603WAF1003T5E: Type:Thick Film Resistor Resistance:100kΩ Tolerance:±1% Tolerance:±1% Power(Watts):100mW Voltage-Supply(Max):75V Temperature Coefficient:±100ppm/℃ Temperature Coefficient:±100ppm/℃ Operating Temperature:-55℃~+155℃ Operating Temperature:-55℃~+155℃; LCSC Part Name: 厚膜电阻 100kΩ ±1%; Supplier Part: C25803; Manufacturer: UNI-ROYAL(厚声); Supplier Footprint: 0603; JLCPCB Part Class: Basic Part; Datasheet: https://item.szlcsc.com/datasheet/0603WAF1003T5E/26546.html; Supplier: LCSC; Type: Thick Film Resistor; Tolerance: ±1%; Power(Watts): 100mW; Voltage-Supply(Max): 75V; Temperature Coefficient: ±100ppm/℃; Operating Temperature: -55℃~+155℃
R81 R84 R97 = RC0603JR-0710KL: Type:Thick Film Resistor Resistance:10kΩ Tolerance:±5% Tolerance:±5% Power(Watts):100mW Voltage-Supply(Max):75V Temperature Coefficient:±100ppm/℃ Temperature Coefficient:±100ppm/℃ Operating Temperature:-55℃~+155℃ Operating Temperature:-55℃~+155℃; LCSC Part Name: 厚膜电阻 10kΩ ±5% 100mW; Supplier Part: C99198; Manufacturer: YAGEO(国巨); Supplier Footprint: 0603; JLCPCB Part Class: Extended Part; Datasheet: https://item.szlcsc.com/datasheet/RC0603JR-0710KL/100411.html; Supplier: LCSC; Type: Thick Film Resistor; Tolerance: ±5%; Power(Watts): 100mW; Voltage-Supply(Max): 75V; Temperature Coefficient: ±100ppm/℃; Operating Temperature: -55℃~+155℃
R98-R101 R132 R139 R140 = RC0603FR-07100KL: Type:Thick Film Resistor Resistance:100kΩ Tolerance:±1% Tolerance:±1% Power(Watts):100mW Voltage-Supply(Max):75V Temperature Coefficient:±100ppm/℃ Temperature Coefficient:±100ppm/℃ Operating Temperature:-55℃~+155℃ Operating Temperature:-55℃~+155℃; LCSC Part Name: 厚膜电阻 100kΩ ±1%; Supplier Part: C14675; Manufacturer: YAGEO(国巨); Supplier Footprint: 0603; JLCPCB Part Class: Extended Part; Datasheet: https://item.szlcsc.com/datasheet/RC0603FR-07100KL/15343.html; Supplier: LCSC; Type: Thick Film Resistor; Tolerance: ±1%; Power(Watts): 100mW; Voltage-Supply(Max): 75V; Temperature Coefficient: ±100ppm/℃; Operating Temperature: -55℃~+155℃
U14 U21-U24 = FST3253MTCX: Type:- Voltage Supply Source:Single Supply Voltage - Supply:4V~5.5V Voltage - Supply:4V~5.5V Number of lines:- Number of lines:- Current - Output Low(IOL):- Current - Output High(IOH):- Operating temperature:-40℃~+85℃ Operating temperature:-40℃~+85℃ Propa; Supplier Part: C903754; Manufacturer: onsemi(安森美); Supplier Footprint: TSSOP-16; JLCPCB Part Class: Extended Part; Datasheet: https://item.szlcsc.com/datasheet/FST3253MTCX/969192.html; Supplier: LCSC; Voltage Supply Source: Single Supply; Voltage - Supply: 4V~5.5V; Operating temperature: -40℃~+85℃; Propagation Delay: 5.3ns@5.5V,50pF; Quiescent Current: 3uA; Function: Output enable high-impedance；Tri-state output
U25 = U74AHC595G: Supplier Part: C7494908; Manufacturer: UTC(友顺); Supplier Footprint: TSSOP-16; JLCPCB Part Class: Extended Part; Supplier: LCSC
U26 = CD74HC238PW: Type:- Voltage Supply Source:Single Supply Voltage - Supply:2V~6V Voltage - Supply:2V~6V Current - Output Low(IOL):5.2mA Current - Output High(IOH):5.2mA Operating temperature:-55℃~+125℃ Operating temperature:-55℃~+125℃ Function:- Series:74HC; Supplier Part: C1547289; Manufacturer: TI(德州仪器); Supplier Footprint: TSSOP-16; JLCPCB Part Class: Extended Part; Datasheet: https://www.ti.com/cn/lit/ds/symlink/cd74hc238.pdf; Supplier: LCSC; Voltage Supply Source: Single Supply; Voltage - Supply: 2V~6V; Current - Output Low(IOL): 5.2mA; Current - Output High(IOH): 5.2mA; Operating temperature: -55℃~+125℃; Series: 74HC
C58-C60 C67 C72 C73 C78 C79 C186 = C1608JB1H104M080AA: Capacitance:100nF Tolerance:±20% Tolerance:±20% Voltage Rating:50V Temperature Coefficient:-; LCSC Part Name: 100nF ±20% 50V; Supplier Part: C19426095; Manufacturer: TDK; Supplier Footprint: 0603; JLCPCB Part Class: Extended Part; Datasheet: https://item.szlcsc.com/datasheet/C1608JB1H104M080AA/20714413.html; Supplier: LCSC; Tolerance: ±20%; Voltage Rating: 50V
C63 C65 C69 C70 = MT18N101K101CT: Capacitance:100pF Tolerance:±10% Tolerance:±10% Voltage Rating:100V Temperature Coefficient:NP0; LCSC Part Name: 100pF ±10% 100V; Supplier Part: C4354964; Manufacturer: Walsin(华新科); Supplier Footprint: 0603; JLCPCB Part Class: Extended Part; Datasheet: https://item.szlcsc.com/datasheet/MT18N101K101CT/4924909.html; Supplier: LCSC; Tolerance: ±10%; Voltage Rating: 100V; Temperature Coefficient: NP0
C64 C66 C68 C71 = CL21A226MAQNNNE: Capacitance:22uF Tolerance:±20% Tolerance:±20% Voltage Rating:25V Temperature Coefficient:X5R; LCSC Part Name: 22uF ±20% 25V; Supplier Part: C45783; Manufacturer: SAMSUNG(三星); Supplier Footprint: 0805; JLCPCB Part Class: Basic Part; Datasheet: https://item.szlcsc.com/datasheet/CL21A226MAQNNNE/46786.html; Supplier: LCSC; Tolerance: ±20%; Voltage Rating: 25V; Temperature Coefficient: X5R
C74-C77 = CL10B223KB8NNNC: Capacitance:22nF Tolerance:±10% Tolerance:±10% Voltage Rating:50V Temperature Coefficient:X7R; LCSC Part Name: 22nF ±10% 50V; Supplier Part: C21122; Manufacturer: SAMSUNG(三星); Supplier Footprint: 0603; JLCPCB Part Class: Basic Part; Datasheet: https://item.szlcsc.com/datasheet/CL10B223KB8NNNC/21834.html; Supplier: LCSC; Tolerance: ±10%; Voltage Rating: 50V; Temperature Coefficient: X7R
L12-L14 = PBY160808T-501Y-N: Impedance @ Frequency:500Ω@100MHz Tolerance:±25% Tolerance:±25% DC Resistance(DCR):- Current Rating:- Number of Circuits:1 Operating Temperature:-55℃~+125℃ Operating Temperature:-55℃~+125℃; LCSC Part Name: 单路 0603磁珠 阻抗500Ω@100MHz; Supplier Part: C142070; Manufacturer: Chilisin(奇力新); Supplier Footprint: 0603; JLCPCB Part Class: Extended Part; Datasheet: https://item.szlcsc.com/datasheet/PBY160808T-501Y-N/153401.html; Supplier: LCSC; Impedance @ Frequency: 500Ω@100MHz; Tolerance: ±25%; Number of Circuits: 1; Operating Temperature: -55℃~+125℃
Q5 Q8 = 2N7002_C28646312: Number:1 N-channel Drain to Source Voltage:60V Current - Continuous Drain(Id):300mA RDS(on):2.5Ω@4.5V Pd - Power Dissipation:350mW Gate Threshold Voltage (Vgs(th)):1.6V Gate Charge(Qg):3nC@4.5V Input Capacitance(Ciss):27pF Reverse Transfer Capacitance (Cr; LCSC Part Name: 耐压:60V 电流:0.3A; Supplier Part: C28646312; Manufacturer: TECH PUBLIC(台舟); Supplier Footprint: SOT-23; JLCPCB Part Class: Extended Part; Datasheet: https://item.szlcsc.com/datasheet/2N7002/30381595.html; Supplier: LCSC; Number: 1 N-channel; Drain to Source Voltage: 60V; Current - Continuous Drain(Id): 300mA; RDS(on): 2.5Ω@4.5V; Pd - Power Dissipation: 350mW; Gate Threshold Voltage (Vgs(th)): 1.6V; Gate Charge(Qg): 3nC@4.5V; Input Capacitance(Ciss): 27pF; Reverse Transfer Capacitance (Crss@Vds): 2pF; Operating Temperature: -55℃~+150℃; Output Capacitance(Coss): 18pF
R52-R54 R56 R58 R59 R61 R63 R66 R67 R133 R137 R138 R141 R142 = CRG0603F10K: Type:Thick Film Resistor Resistance:10kΩ Tolerance:±1% Tolerance:±1% Power(Watts):100mW Voltage-Supply(Max):75V Temperature Coefficient:±100ppm/℃ Temperature Coefficient:±100ppm/℃ Operating Temperature:-55℃~+155℃ Operating Temperature:-55℃~+155℃; LCSC Part Name: 厚膜电阻 10kΩ ±1% 100mW; Supplier Part: C2073661; Manufacturer: TE Connectivity(泰科电子); Supplier Footprint: 0603; JLCPCB Part Class: Extended Part; Datasheet: https://item.szlcsc.com/datasheet/CRG0603F10K/2165247.html; Supplier: LCSC; Type: Thick Film Resistor; Tolerance: ±1%; Power(Watts): 100mW; Voltage-Supply(Max): 75V; Temperature Coefficient: ±100ppm/℃; Operating Temperature: -55℃~+155℃
R55 R57 R60 R62 R64 R65 = SCR0603F47R: Type:Thick Film Resistor Resistance:47Ω Tolerance:±1% Tolerance:±1% Power(Watts):100mW Voltage-Supply(Max):75V Operating Temperature:-55℃~+155℃ Operating Temperature:-55℃~+155℃; LCSC Part Name: 厚膜电阻 47Ω ±1% 100mW; Supplier Part: C3016437; Manufacturer: VO(翔胜); Supplier Footprint: 0603; JLCPCB Part Class: Extended Part; Datasheet: https://item.szlcsc.com/datasheet/SCR0603F47R/3528891.html; Supplier: LCSC; Type: Thick Film Resistor; Tolerance: ±1%; Power(Watts): 100mW; Voltage-Supply(Max): 75V; Operating Temperature: -55℃~+155℃
R72 R134 = 0603WAF180JT5E: Type:Thick Film Resistor Resistance:18Ω Tolerance:±1% Tolerance:±1% Power(Watts):100mW Voltage-Supply(Max):75V Temperature Coefficient:±200ppm/℃ Temperature Coefficient:±200ppm/℃ Operating Temperature:-55℃~+155℃ Operating Temperature:-55℃~+155℃; LCSC Part Name: 18Ω ±1% 100mW 厚膜电阻; Supplier Part: C22830; Manufacturer: UNI-ROYAL(厚声); Supplier Footprint: 0603; JLCPCB Part Class: Extended Part; Datasheet: https://item.szlcsc.com/datasheet/0603WAF180JT5E/23557.html; Supplier: LCSC; Type: Thick Film Resistor; Tolerance: ±1%; Power(Watts): 100mW; Voltage-Supply(Max): 75V; Temperature Coefficient: ±200ppm/℃; Operating Temperature: -55℃~+155℃
R74 R75 R135 R136 = RC0603FR-07300RL: Type:Thick Film Resistors Resistance: Tolerance:±1% Tolerance:±1% Power(Watts): Overload Voltage (Max): Temperature Coefficient:±100ppm/℃ Temperature Coefficient:±100ppm/℃ Operating Temperature Range:-55℃~+155℃ Operating Temperature Range:-55℃~+155℃; LCSC Part Name: 厚膜电阻 300Ω ±1% 100mW; Supplier Part: C114617; Manufacturer: YAGEO(国巨); Supplier Footprint: 0603; JLCPCB Part Class: Extended Part; Datasheet: https://atta.szlcsc.com/upload/public/pdf/source/20180821/C275644_0D56F95EFF785E7D9A1FEF436B37DA78.pdf; Supplier: LCSC; Type: Thick Film Resistors; Tolerance: ±1%; Temperature Coefficient: ±100ppm/℃; Operating Temperature Range: -55℃~+155℃
U13 = OPA4350EA/2K5: Number of Channels:4 Rail to Rail:Rail-to-Rail Input, Rail-to-Rail Output Gain Bandwidth Product:38MHz Vos - Input Offset Voltage:500uV Input Offset Voltage Drift(Vos TC):4uV/℃ Slew Rate:22V/us Ib - Input Bias Current:0.5pA Input Offset Current(Ios):0.5pA; LCSC Part Name: OPAx350 MicroAmplifier高速单电源轨至轨运算放大器; Supplier Part: C2868151; Manufacturer: TI(德州仪器); Supplier Footprint: SSOP-16-150mil; JLCPCB Part Class: Extended Part; Datasheet: https://www.ti.com/cn/lit/ds/symlink/opa350.pdf; Supplier: LCSC; Number of Channels: 4; Rail to Rail: Rail-to-Rail Input, Rail-to-Rail Output; Gain Bandwidth Product: 38MHz; Vos - Input Offset Voltage: 500uV; Input Offset Voltage Drift(Vos TC): 4uV/℃; Slew Rate: 22V/us; Ib - Input Bias Current: 0.5pA; Input Offset Current(Ios): 0.5pA; Input Voltage Noise Density: 7nV/√Hz@10kHz; Common Mode Rejection Ratio(CMRR): 90dB; Quiescent Current: 5.2mA; Output Current: 40mA; Operating Temperature: -40℃~+85℃; Single supply: 2.7V~5.5V; Dual Supply: 1.35V~2.75V；-2.75V~-1.35V; Features: Built-in compensation
U15 U19 U20 = TC4-1T+: Applications:- Function:Transformer Frequency Range:200kHz~450MHz Frequency Range:200kHz~450MHz Voltage - Supply:- Voltage - Supply:- Operating Temperature:-20℃~+85℃ Operating Temperature:-20℃~+85℃ Features:-; LCSC Part Name: 贴片式射频变压器，50Ω，0.5至300 MHz; Supplier Part: C879856; Manufacturer: Mini-Circuits; Supplier Footprint: SMD,3.8x3.8mm; JLCPCB Part Class: Extended Part; Datasheet: https://item.szlcsc.com/datasheet/TC4-1T%252B/940697.html; Supplier: LCSC; Function: Transformer; Frequency Range: 200kHz~450MHz; Operating Temperature: -20℃~+85℃
C82 C90 = CC0603JRNPO9BN471: Capacitance: Tolerance:±5% Tolerance:±5% Voltage Rated: Temperature Coefficient:; LCSC Part Name: 470pF ±5% 50V; Supplier Part: C106211; Manufacturer: YAGEO(国巨); Supplier Footprint: 0603; JLCPCB Part Class: Extended Part; Datasheet: https://atta.szlcsc.com/upload/public/pdf/source/20170505/1493957838062.pdf; Supplier: LCSC; Tolerance: ±5%
C83 C88 = GCM188D71H105KE36D: Capacitance:1uF Tolerance:±10% Tolerance:±10% Voltage Rating:50V; LCSC Part Name: 1uF ±10% 50V; Supplier Part: C22443289; Manufacturer: muRata(村田); Supplier Footprint: 0603; JLCPCB Part Class: Extended Part; Datasheet: https://item.szlcsc.com/datasheet/GCM188D71H105KE36D/24092295.html; Supplier: LCSC; Tolerance: ±10%; Voltage Rating: 50V
C85 C87 = 0603J0100681GCR: Capacitance:680pF Tolerance:±2% Tolerance:±2% Voltage Rating:10V Temperature Coefficient:-; LCSC Part Name: 680pF ±2% 10V; Supplier Part: C2313341; Manufacturer: Knowles(楼氏); Supplier Footprint: 0603; JLCPCB Part Class: Extended Part; Datasheet: https://item.szlcsc.com/datasheet/0603J0100681GCR/2405437.html; Supplier: LCSC; Tolerance: ±2%; Voltage Rating: 10V
C86 = NL0603B104M500CPBN: Capacitance:100nF Tolerance:±20% Tolerance:±20% Voltage Rating:50V; LCSC Part Name: 100nF ±20% 50V; Supplier Part: C45369465; Manufacturer: HUI JU(汇聚); Supplier Footprint: 0603; Datasheet: https://item.szlcsc.com/datasheet/NL0603B104M500CPBN/47466580.html; Supplier: LCSC; Tolerance: ±20%; Voltage Rating: 50V
C188 = CL10A106MO8NQNC: Capacitance:10uF Tolerance:±20% Tolerance:±20% Voltage Rating:16V Temperature Coefficient:X5R; LCSC Part Name: 10uF ±20% 16V; Supplier Part: C92487; Manufacturer: SAMSUNG(三星); Supplier Footprint: 0603; JLCPCB Part Class: Extended Part; Datasheet: https://item.szlcsc.com/datasheet/CL10A106MO8NQNC/93680.html; Supplier: LCSC; Tolerance: ±20%; Voltage Rating: 16V; Temperature Coefficient: X5R
Q4 = IRLML6402_C5807881: Number:1 P-Channel Drain to Source Voltage:20V Current - Continuous Drain(Id):3.7A RDS(on):80mΩ@2.5V Pd - Power Dissipation:1.3W Gate Threshold Voltage (Vgs(th)):550mV Gate Charge(Qg):8nC@10V Input Capacitance(Ciss):633pF Reverse Transfer Capacitance (Crs; LCSC Part Name: 1个P沟道 耐压:20V 电流:3.7A; Supplier Part: C5807881; Manufacturer: GOODWORK(固得沃克); Supplier Footprint: SOT-23; JLCPCB Part Class: Extended Part; Datasheet: https://item.szlcsc.com/datasheet/IRLML6402/6737090.html; Supplier: LCSC; Number: 1 P-Channel; Drain to Source Voltage: 20V; Current - Continuous Drain(Id): 3.7A; RDS(on): 80mΩ@2.5V; Pd - Power Dissipation: 1.3W; Gate Threshold Voltage (Vgs(th)): 550mV; Gate Charge(Qg): 8nC@10V; Input Capacitance(Ciss): 633pF; Reverse Transfer Capacitance (Crss@Vds): 110pF; Operating Temperature: -55℃~+150℃; Type: P-Channel; Output Capacitance(Coss): 145pF
R68 R69 R82 R83 = FRC0603F1001TS: Type:Thick Film Resistor Resistance:1kΩ Tolerance:±1% Tolerance:±1% Power(Watts):100mW Voltage-Supply(Max):75V Temperature Coefficient:±100ppm/℃ Temperature Coefficient:±100ppm/℃ Operating Temperature:-55℃~+155℃ Operating Temperature:-55℃~+155℃; LCSC Part Name: 1kΩ ±1% 100mW 厚膜电阻; Supplier Part: C2907002; Manufacturer: FOJAN(富捷); Supplier Footprint: 0603; JLCPCB Part Class: Extended Part; Datasheet: https://item.szlcsc.com/datasheet/FRC0603F1001TS/3180515.html; Supplier: LCSC; Type: Thick Film Resistor; Tolerance: ±1%; Power(Watts): 100mW; Voltage-Supply(Max): 75V; Temperature Coefficient: ±100ppm/℃; Operating Temperature: -55℃~+155℃
R70 R79 = TD03G22R0BT: Type:Thin Film Resistor Resistance:22Ω Tolerance:±0.1% Tolerance:±0.1% Power(Watts):100mW Voltage-Supply(Max):50V Temperature Coefficient:±25ppm/℃ Temperature Coefficient:±25ppm/℃ Operating Temperature:-55℃~+155℃ Operating Temperature:-55℃~+155℃; LCSC Part Name: 薄膜电阻 22Ω ±0.1% 100mW; Supplier Part: C657279; Manufacturer: FH(风华); Supplier Footprint: 0603; JLCPCB Part Class: Extended Part; Datasheet: https://item.szlcsc.com/datasheet/TD03G22R0BT/696029.html; Supplier: LCSC; Type: Thin Film Resistor; Tolerance: ±0.1%; Power(Watts): 100mW; Voltage-Supply(Max): 50V; Temperature Coefficient: ±25ppm/℃; Operating Temperature: -55℃~+155℃
R71 R80 = FRC0603J5R6 TS: Type:Thick Film Resistor Resistance:5.6Ω Tolerance:±5% Tolerance:±5% Power(Watts):100mW Voltage-Supply(Max):75V Temperature Coefficient:±400ppm/℃ Temperature Coefficient:±400ppm/℃ Operating Temperature:-55℃~+155℃ Operating Temperature:-55℃~+155℃; LCSC Part Name: 厚膜电阻 5.6Ω ±5% 100mW; Supplier Part: C2933277; Manufacturer: FOJAN(富捷); Supplier Footprint: 0603; JLCPCB Part Class: Extended Part; Datasheet: https://item.szlcsc.com/datasheet/FRC0603J5R6%2520TS/3279379.html; Supplier: LCSC; Type: Thick Film Resistor; Tolerance: ±5%; Power(Watts): 100mW; Voltage-Supply(Max): 75V; Temperature Coefficient: ±400ppm/℃; Operating Temperature: -55℃~+155℃
R73 = SCR0603J100R: Type:Thick Film Resistors Resistance: Tolerance:±5% Tolerance:±5% Power(Watts): Overload Voltage (Max): Operating Temperature Range:-55℃~+155℃ Operating Temperature Range:-55℃~+155℃; LCSC Part Name: 厚膜电阻 100Ω ±5% 100mW; Supplier Part: C3017758; Manufacturer: VO(翔胜); Supplier Footprint: 0603; JLCPCB Part Class: Extended Part; Datasheet: https://atta.szlcsc.com/upload/public/pdf/source/20220513/247AF9639BA21CF93567DC289CCC6A22.pdf; Supplier: LCSC; Type: Thick Film Resistors; Tolerance: ±5%; Operating Temperature Range: -55℃~+155℃
R76 = SCR0603J220R: Type:Thick Film Resistors Resistance: Tolerance:±5% Tolerance:±5% Power(Watts): Overload Voltage (Max): Operating Temperature Range:-55℃~+155℃ Operating Temperature Range:-55℃~+155℃; LCSC Part Name: 厚膜电阻 220Ω ±5% 100mW; Supplier Part: C3017752; Manufacturer: VO(翔胜); Supplier Footprint: 0603; JLCPCB Part Class: Extended Part; Datasheet: https://atta.szlcsc.com/upload/public/pdf/source/20220513/247AF9639BA21CF93567DC289CCC6A22.pdf; Supplier: LCSC; Type: Thick Film Resistors; Tolerance: ±5%; Operating Temperature Range: -55℃~+155℃
R77 R78 = SCR0603F470R: Type:Thick Film Resistor Resistance:470Ω Tolerance:±1% Tolerance:±1% Power(Watts):100mW Voltage-Supply(Max):75V Temperature Coefficient:±100ppm/℃ Temperature Coefficient:±100ppm/℃ Operating Temperature:-55℃~+155℃ Operating Temperature:-55℃~+155℃; LCSC Part Name: 厚膜电阻 470Ω ±1% 100mW; Supplier Part: C5140094; Manufacturer: VO(翔胜); Supplier Footprint: 0603; JLCPCB Part Class: Extended Part; Datasheet: https://item.szlcsc.com/datasheet/SCR0603F470R/5753171.html; Supplier: LCSC; Type: Thick Film Resistor; Tolerance: ±1%; Power(Watts): 100mW; Voltage-Supply(Max): 75V; Temperature Coefficient: ±100ppm/℃; Operating Temperature: -55℃~+155℃
U18 = OPA2675RGVR: Number of Channels:2 Rail to Rail:- Gain Bandwidth Product:340MHz Vos - Input Offset Voltage:1.5mV Input Offset Voltage Drift(Vos TC):3uV/℃ Slew Rate:3.5V/ns Ib - Input Bias Current:5uA Input Offset Current(Ios):- Input Voltage Noise Density:2.4nV/√Hz@1kH; LCSC Part Name: 具有主动离线控制的双路高输出电流运算放大器; Supplier Part: C19711669; Manufacturer: TI(德州仪器); Supplier Footprint: VQFN-16(4x4); JLCPCB Part Class: Extended Part; Datasheet: https://item.szlcsc.com/datasheet/OPA2675RGVR/21021438.html; Supplier: LCSC; Number of Channels: 2; Gain Bandwidth Product: 340MHz; Vos - Input Offset Voltage: 1.5mV; Input Offset Voltage Drift(Vos TC): 3uV/℃; Slew Rate: 3.5V/ns; Ib - Input Bias Current: 5uA; Input Voltage Noise Density: 2.4nV/√Hz@1kHz; Common Mode Rejection Ratio(CMRR): 62dB; Quiescent Current: 33mA; Output Current: 1A; Operating Temperature: -40℃~+85℃; Single supply: 4.5V~13V; Dual Supply: 2.5V~6.5V；-6.5V~-2.5V; Features: Enable/shutdown function

## Nets
3V3_LO: R133.1 ; also on sheet 3 12
3V3_MCU: L17.2 R105.2 ; also on sheet 1 2 11 12
5VA: FB1.2 FB2.2 FB3.2 L12.2 L14.2 ; also on sheet 4 12
8V: L16.2 ; also on sheet 12 13
8V_RF: C89.2 C90.2 C91.2 C188.2 Q4.3(D) R69.1 U18.14(+VS)
GND: C58.1 C59.1 C60.1 C62.1 C72.1 C73.1 C74.1 C75.1 C76.1 C77.1 C81.1 C82.1 C89.1 C90.1 C91.1 C92.1 C93.1 C96.1 C97.1 C98.1 C99.1 C100.1 C101.1 C106.1 C107.2 C108.1 C109.1 C110.2 C111.1 C116.1 C117.2 C118.1 C119.1 C120.2 C121.1 C126.1 C127.2 C128.1 C129.1 C130.2 C131.1 C134.1 C135.2 C136.1 C137.1 C140.1 C141.1 C142.1 C176.1 C177.1 C178.1 C182.1 C186.1 C188.1 L21.1 L22.1 L28.1 L29.1 L33.1 L34.1 L38.1 Q5.2(S) Q8.2(S) R53.1 R68.2 R74.1 R75.1 R84.1 R90.1 R91.1 R94.1 R95.1 R135.1 R136.1 U13.13(V-) U14.8(GND) U15.6 U18.4(GND) U18.7(-VS) U18.8(A0) U18.9(A1) U18.17(EP) U19.4 U20.3 U21.8(GND) U22.8(GND) U23.8(GND) U24.8(GND) U25.8(GND) U26.4(G0#) U26.5(G1#) U26.8(GND) U27.1(C16) U27.7(PUP1) U27.8(PUP2) U27.10(GND) U27.11(GND) U27.12(VSS/GND) U27.15(C8) U27.16(C4) U27.17(C2) U27.18(GND) U27.19(C1) U27.20(C5) U27.21(GND) ; also on sheet 1 2 3 4 11 12 13 14
ATT_LATCH: U27.5(LE) ; also on sheet 1
B0: U26.15(Y0)
B1: U26.14(Y1)
B2: U26.13(Y2)
B3: U26.12(Y3)
B4: U26.11(Y4)
B5: U26.10(Y5)
B6: U26.9(Y6)
BPF_OE: R97.1 U25.13(OE#) ; also on sheet 1
BPF_RCLK: U25.12(RCLK) ; also on sheet 1
CTL_SCK: R103.1 U27.4(CLK) ; also on sheet 1
CTL_SDO: C140.2 R102.1 R104.1 ; also on sheet 1
I_BIAS: R142.2 ; also on sheet 1
I_OUT: R61.1 ; also on sheet 2
IN_B1: L18.1 U21.3(1B4) U21.13(2B4)
IN_B2: L24.1 U21.4(IB3) U21.12(2B3)
IN_B3: L30.1 U21.5(IB2) U21.11(2B2)
IN_B4: L36.1 U21.6(IB1) U21.10(2B1)
IN_B5: L20.1 U23.3(1B4) U23.13(2B4)
IN_B6: L26.1 U23.4(IB3) U23.12(2B3)
IN_B7: L32.1 U23.5(IB2) U23.11(2B2)
IN_RX: C139.2 R93.2 U22.7(1A) U24.7(1A)
LPF_A0: U26.1(A0) ; also on sheet 1
LPF_A1: U26.2(A1) ; also on sheet 1
LPF_A2: U26.3(A2) ; also on sheet 1
OE1.1: R98.1 U21.1(OE1#) U22.1(OE1#) U25.1(QB)
OE1.2: R99.1 U21.15(OE2#) U22.15(OE2#) U25.4(QE)
OE2.1: R100.1 U23.1(OE1#) U24.1(OE1#) U25.5(QF)
OE2.2: R101.1 U23.15(OE2#) U24.15(OE2#) U25.6(QG)
OUT_B1: L19.2 U22.3(1B4) U22.13(2B4)
OUT_B2: L25.2 U22.4(IB3) U22.12(2B3)
OUT_B3: L31.2 U22.5(IB2) U22.11(2B2)
OUT_B4: L37.2 U22.6(IB1) U22.10(2B1)
OUT_B5: L23.2 U24.3(1B4) U24.13(2B4)
OUT_B6: L27.2 U24.4(IB3) U24.12(2B3)
OUT_B7: L35.2 U24.5(IB2) U24.11(2B2)
OUT_TX: U20.1 ; also on sheet 13
Q_BIAS: R141.2 ; also on sheet 1
Q_OUT: R58.1 ; also on sheet 2
QSD_IN: R89.1 U21.7(1A) U23.7(1A) ; also on sheet 4
RX_ANT: C138.1 ; also on sheet 13
S0: U21.14(S0) U22.14(S0) U23.14(S0) U24.14(S0) U25.3(QD)
S1: U21.2(S1) U22.2(S1) U23.2(S1) U24.2(S1) U25.2(QC)
T/R_SW: Q8.1(G) R83.1 ; also on sheet 1 4 13
T_CLK_S0: U14.14(S0) ; also on sheet 3
T_CLK_S1: U14.2(S1) ; also on sheet 3
TX_BIAS: C60.2 C62.2 L13.1 R52.2 R53.2 R137.1 R138.1 U13.12(INC+) U13.14(IND+)
TX_BPF_IN: C78.1 R92.1 U21.9(2A) U23.9(2A)
TX_PRE_IN: C79.2 R96.1 U22.9(2A) U24.9(2A)
$6N1: C77.2 R55.2 U14.6(IB1) U14.13(2B4)
$6N2: C76.2 R62.2 U14.5(IB2) U14.12(2B3)
$6N3: C75.2 R65.2 U14.4(IB3) U14.11(2B2)
$6N4: C74.2 R60.2 U14.3(1B4) U14.10(2B1)
$6N5: R64.2 U15.1
$6N6: R57.2 U15.3
$6N8: C68.1 C70.1 R63.1 U13.10(OUTC)
$6N10: C69.1 R61.2 R66.1 U13.6(INB-)
$6N11: C63.2 C66.1 R54.1 R59.2 U13.1(OUTA)
$6N12: C63.1 R58.2 R59.1 U13.2(INA-)
$6N13: C65.1 R54.2 R56.1 U13.15(IND-)
$6N14: C64.1 C65.2 R56.2 U13.16(OUTD)
$6N15: C64.2 R55.1
$6N16: C66.2 R60.1
$6N17: C68.2 R62.1
$6N18: C71.2 R65.1
$6N24: R64.1 U14.7(1A)
$6N25: R57.1 U14.9(2A)
$6N32: C69.2 C71.1 R66.2 R67.1 U13.7(OUTB)
$6N36: C186.2 Q8.3(D) R133.2 U14.1(OE1#) U14.15(OE2#)
$6N42: C58.2 C59.2 L12.1 R52.1 U14.16(VCC)
$6N43: C72.2 L13.2 U15.2
$6N54: C73.2 L14.1 U13.4(V+)
$6N76: C67.1 U15.4
$6N77: C67.2 R134.1 R135.2
$6N78: C78.2 R134.2 R136.2
$6N83: C70.2 R63.2 R67.2 U13.11(INC-)
$6N86: C176.2 R137.2 R140.1 U13.3(INA+)
$6N91: C177.2 R138.2 R139.1 U13.5(INB+)
$6N93: C182.2 R139.2 R142.1
$6N94: C178.2 R140.2 R141.1
$7N1: R70.1 R76.2 U19.1
$7N2: R76.1 R79.1 U19.3
$7N3: R79.2 U18.10(IN2+)
$7N4: R70.2 U18.3(IN1+)
$7N5: C86.1 R78.1 U18.11(IN2-)
$7N6: C86.2 R73.1
$7N7: R73.2 R77.1 U18.2(IN1-)
$7N8: R71.1 R77.2 U18.16(OUT1)
$7N9: R78.2 R80.1 U18.13(OUT2)
$7N10: C83.1 C85.1 R71.2
$7N11: C87.1 C88.1 R80.2
$7N12: C87.2 C88.2 U20.4
$7N13: C83.2 C85.2 U20.6
$7N15: Q4.1(G) R81.1 R82.2
$7N17: Q5.1(G) R83.2 R84.2
$7N30: C84.2 U19.6
$7N32: C84.1 R72.2 R75.2
$7N33: C79.1 R72.1 R74.2
$7N38: C81.2 C82.2 R68.1 R69.2 U19.2
$7N41: L16.1 Q4.2(S) R81.2
$7N44: Q5.3(D) R82.1
$8N8: U23.6(IB1) U23.10(2B1)
$8N16: U24.6(IB1) U24.10(2B1)
$8N44: C94.1 C95.1
$8N46: C94.2 C95.2 FB2.1 R87.2 R88.2 U22.16(VCC) U24.16(VCC)
$8N47: C92.2 C93.2 FB1.1 R85.2 R86.2 U21.16(VCC) U23.16(VCC)
$8N49: C99.2 R88.1 R95.2 R96.2
$8N50: C98.2 R87.1 R93.1 R94.2
$8N51: C97.2 R86.1 R91.2 R92.2
$8N52: C96.2 R85.1 R89.2 R90.2
$8N71: C100.2 C101.2 L17.1 R97.2 R98.2 R99.2 R100.2 R101.2 R132.2 U25.10(SRCLR#) U25.16(VCC)
$8N85: R102.2 U25.14(SER)
$8N86: R103.2 U25.11(SRCLK)
$8N87: R132.1 U25.7(QH)
$9N4: C103.2 C108.2 L19.1
$9N5: C102.1 C103.1 C107.1 L21.2
$9N6: C102.2 C106.2 L18.2
$9N10: C113.2 C118.2 L25.1
$9N11: C112.1 C113.1 C117.1 L28.2
$9N12: C112.2 C116.2 L24.2
$9N16: C123.2 C128.2 L31.1
$9N17: C122.1 C123.1 C127.1 L33.2
$9N18: C122.2 C126.2 L30.2
$9N22: C133.2 C136.2 L37.1
$9N23: C132.1 C133.1 C135.1 L38.2
$9N24: C132.2 C134.2 L36.2
$9N34: C105.2 C111.2 L23.1
$9N35: C125.2 C131.2 L35.1
$9N36: C115.2 C121.2 L27.1
$9N37: C124.1 C125.1 C130.1 L34.2
$9N38: C104.1 C105.1 C110.1 L22.2
$9N39: C114.1 C115.1 C120.1 L29.2
$9N40: C104.2 C109.2 L20.2
$9N41: C124.2 C129.2 L32.2
$9N42: C114.2 C119.2 L26.2
$10N5: C137.2 FB3.1 U26.6(G2) U26.16(VCC)
$11N18: C138.2 U27.2(RFIN)
$11N26: C141.2 C142.2 R105.1 U27.6(VDD) U27.9(VDD) U27.13(PS)
$11N28: C139.1 U27.14(RFOUT)
$11N32: R104.2 U27.3(DATA)

Not connected (* = marked no-connect by the designer): U13 8(NC)* 9(NC)*; U18 1(NC)* 5(NC)* 6(NC)* 12(NC)* 15(NC)*; U20 2*; U25 9(QH')* 15(QA)*; U26 7(Y7)
